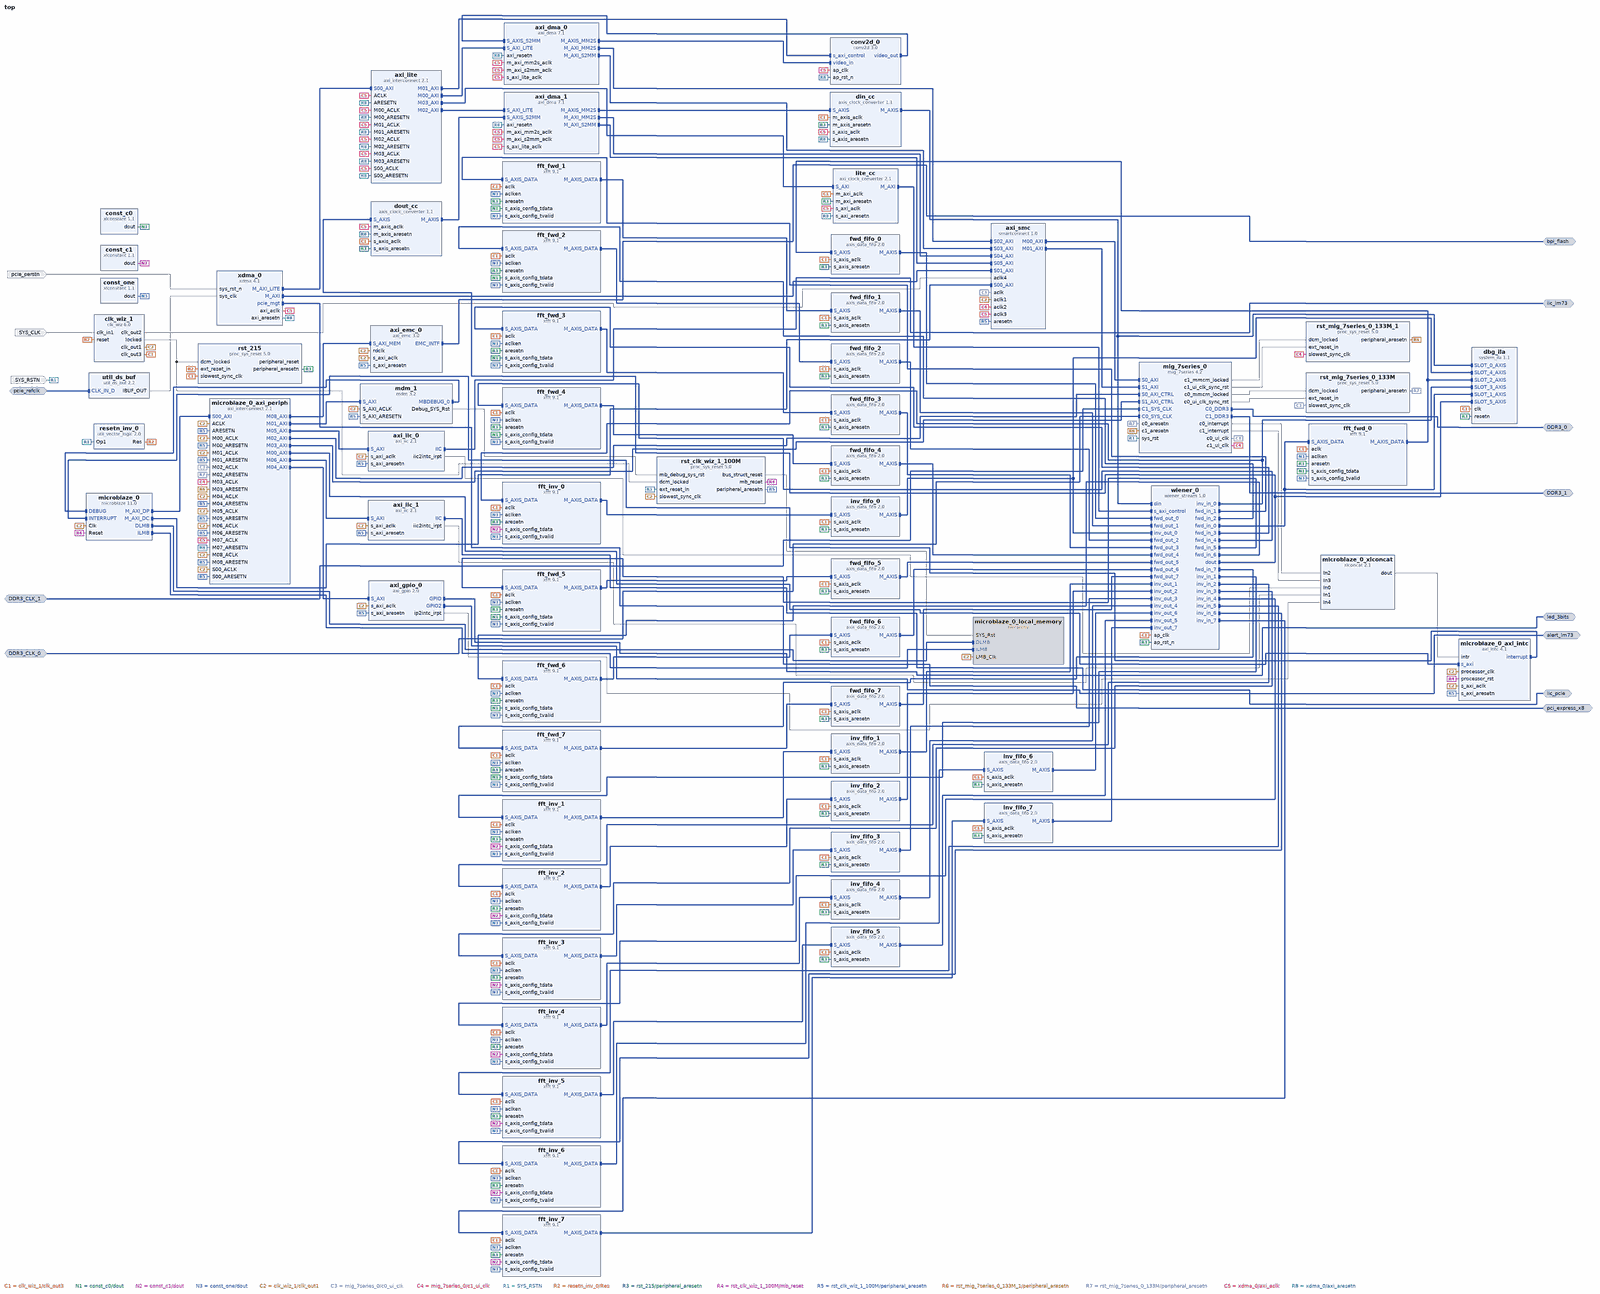
[diagram p0: block diagram of the top level, whole]
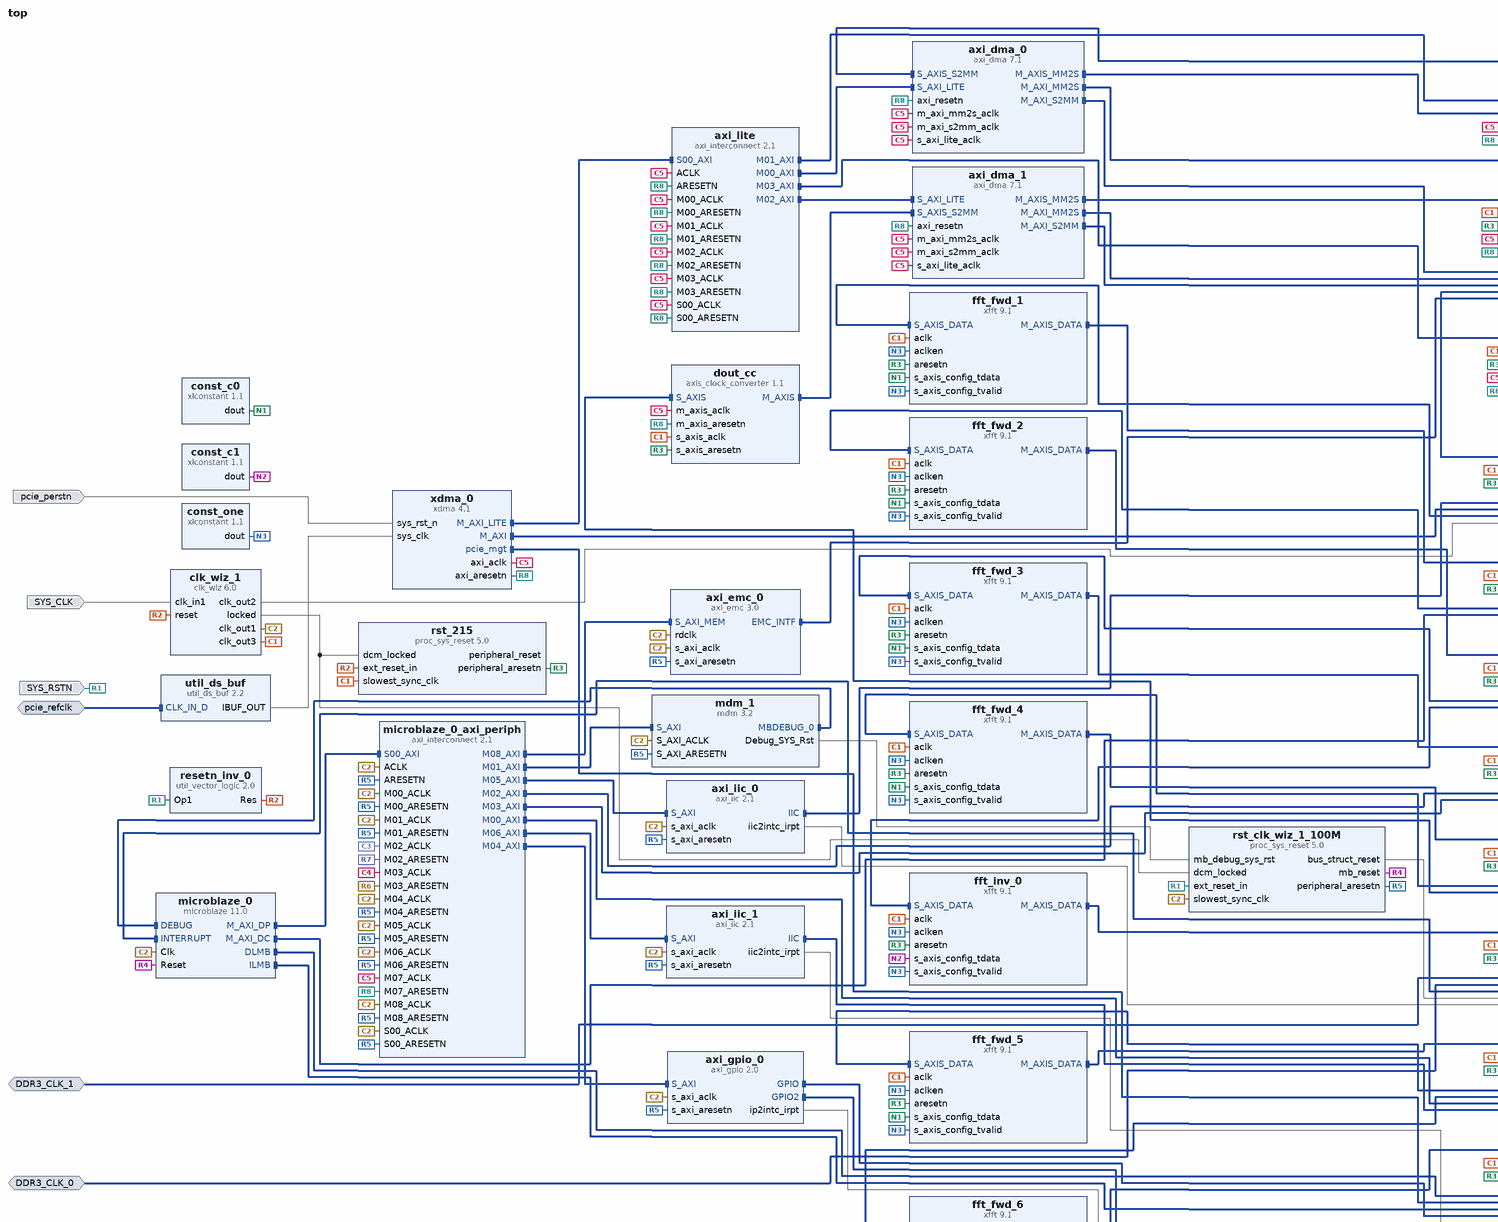
[diagram p1: block diagram of the top level, upper left part]
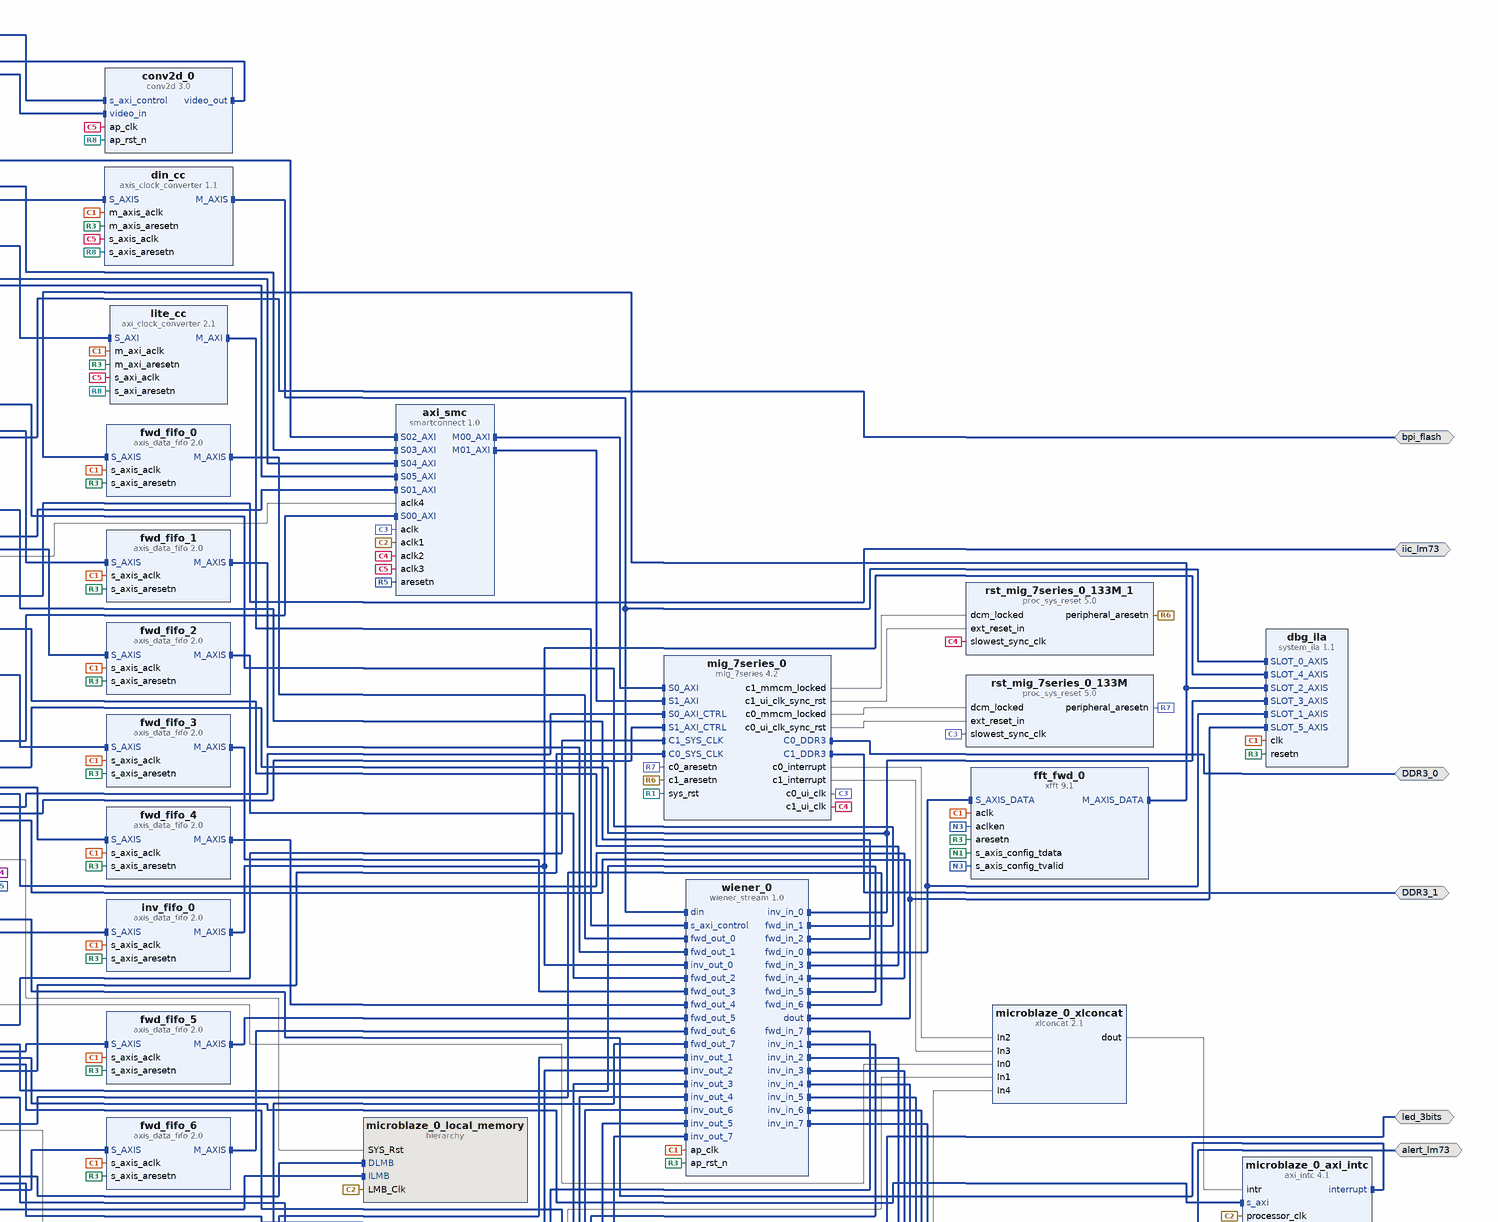
[diagram p2: block diagram of the top level, upper right part]
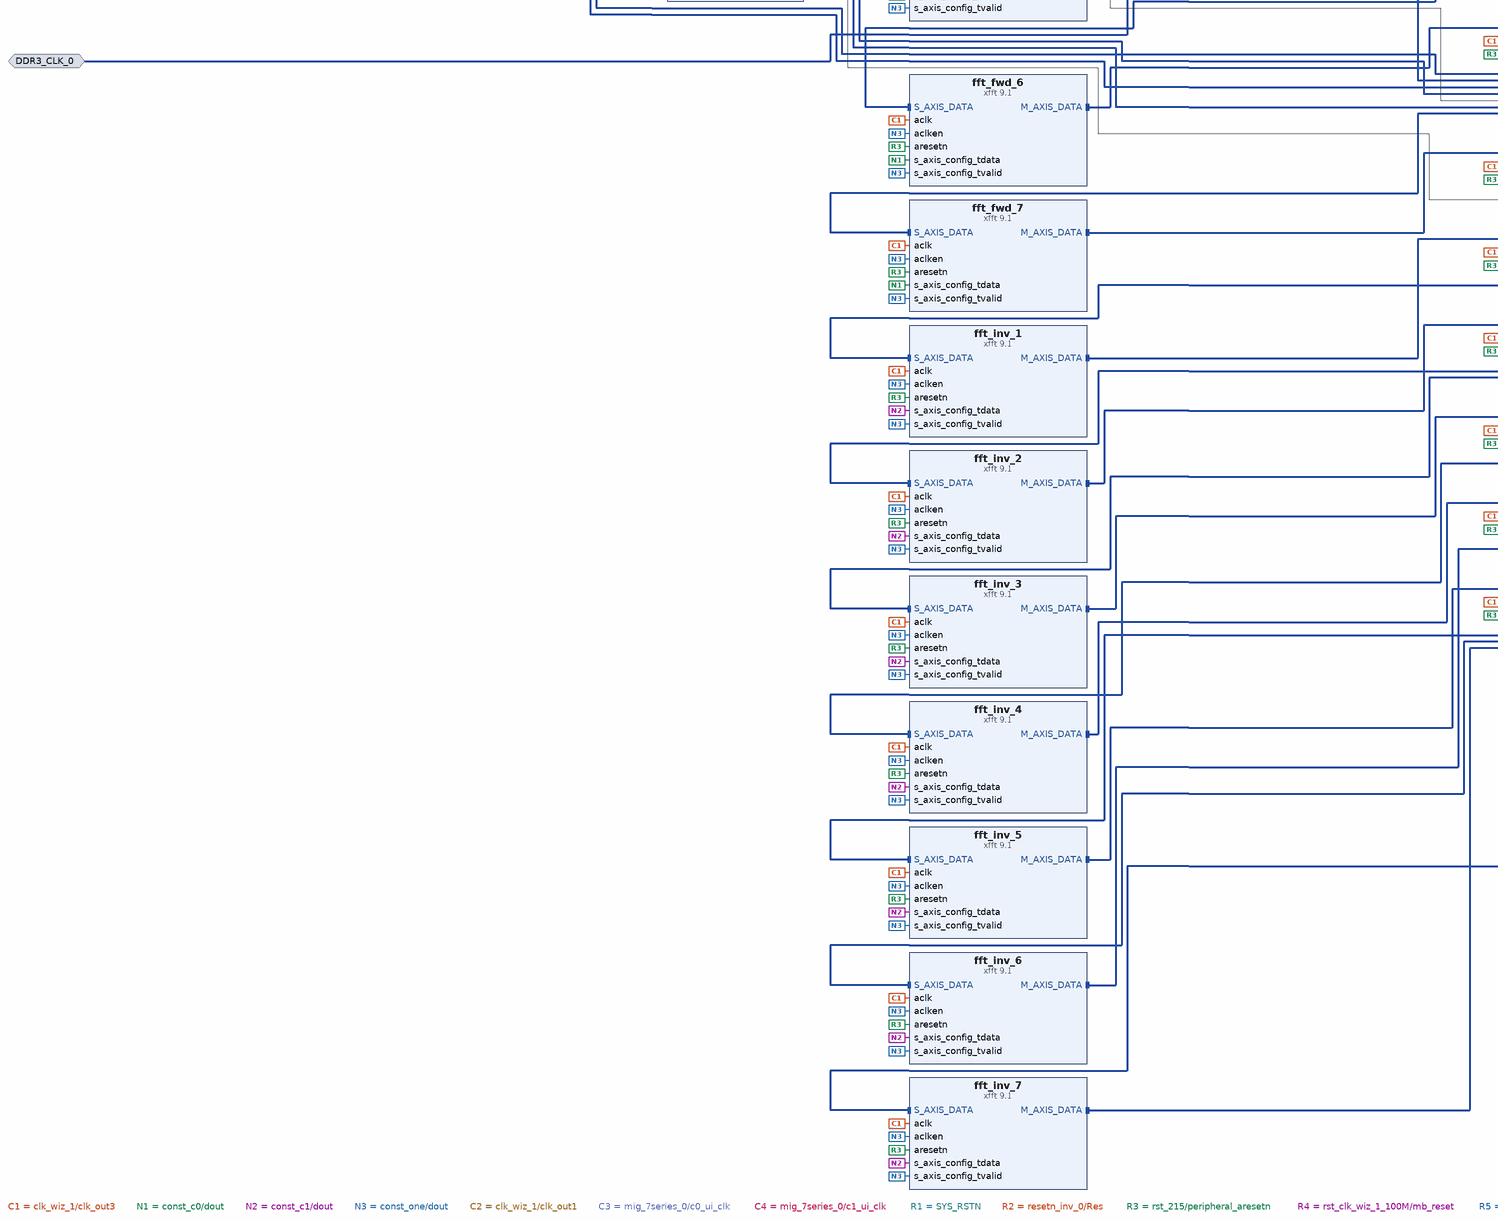
[diagram p3: block diagram of the top level, lower left part]
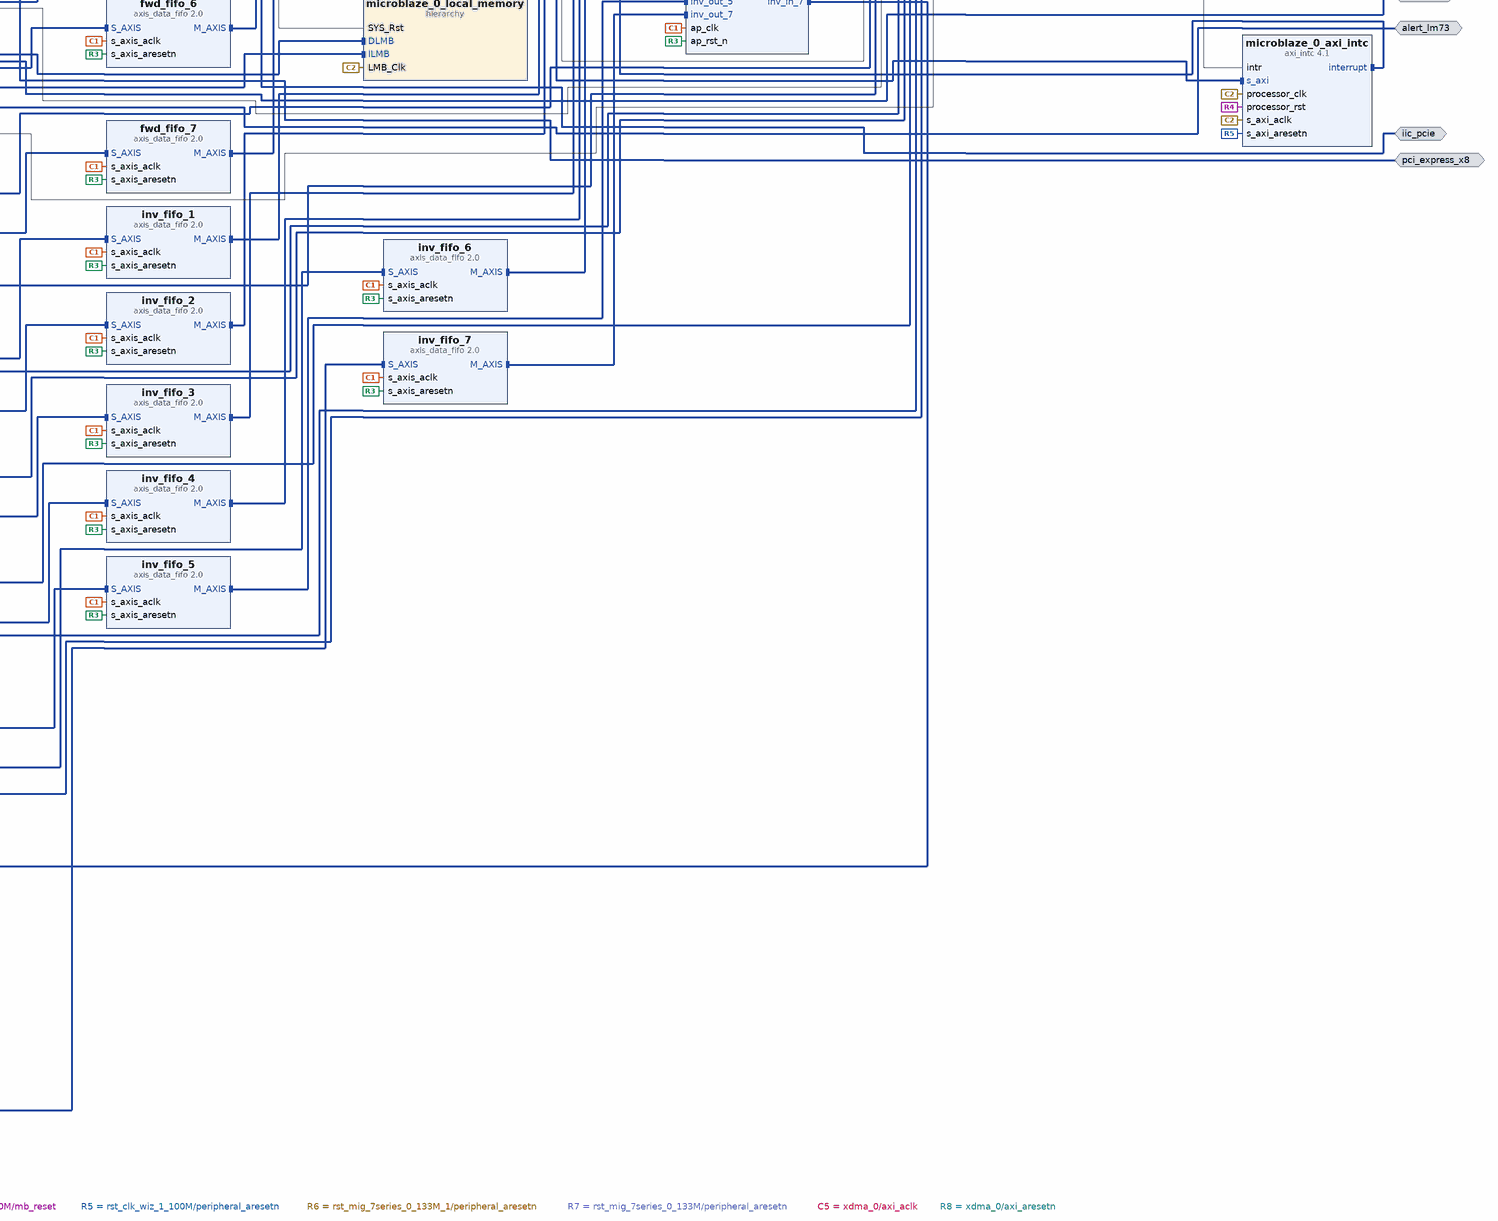
[diagram p4: block diagram of the top level, lower right part]
# Vivado block design top, xc7k480tffg1156-2, Vivado 2024.2
create_bd_design top

create_bd_intf_port -mode Master -vlnv xilinx.com:interface:ddrx_rtl:1.0 DDR3_0
create_bd_intf_port -mode Slave -vlnv xilinx.com:interface:diff_clock_rtl:1.0 DDR3_CLK_0
set_property -dict {CONFIG.FREQ_HZ 100000000} [get_bd_intf_ports DDR3_CLK_0]
create_bd_intf_port -mode Master -vlnv xilinx.com:interface:ddrx_rtl:1.0 DDR3_1
create_bd_intf_port -mode Slave -vlnv xilinx.com:interface:diff_clock_rtl:1.0 DDR3_CLK_1
set_property -dict {CONFIG.FREQ_HZ 100000000} [get_bd_intf_ports DDR3_CLK_1]
create_bd_intf_port -mode Master -vlnv xilinx.com:interface:iic_rtl:1.0 iic_lm73
create_bd_intf_port -mode Master -vlnv xilinx.com:interface:iic_rtl:1.0 iic_pcie
create_bd_intf_port -mode Master -vlnv xilinx.com:interface:pcie_7x_mgt_rtl:1.0 pci_express_x8
create_bd_intf_port -mode Master -vlnv xilinx.com:interface:gpio_rtl:1.0 led_3bits
create_bd_intf_port -mode Master -vlnv xilinx.com:interface:gpio_rtl:1.0 alert_lm73
create_bd_intf_port -mode Master -vlnv xilinx.com:interface:emc_rtl:1.0 bpi_flash
create_bd_intf_port -mode Slave -vlnv xilinx.com:interface:diff_clock_rtl:1.0 pcie_refclk
set_property -dict {CONFIG.FREQ_HZ 100000000} [get_bd_intf_ports pcie_refclk]
create_bd_port -dir I -type clk SYS_CLK
set_property -dict {CONFIG.FREQ_HZ 50000000 CONFIG.PHASE 0.0} [get_bd_ports SYS_CLK]
create_bd_port -dir I -type rst SYS_RSTN
set_property -dict {CONFIG.POLARITY ACTIVE_LOW} [get_bd_ports SYS_RSTN]
create_bd_port -dir I -type rst pcie_perstn
set_property -dict {CONFIG.POLARITY ACTIVE_LOW} [get_bd_ports pcie_perstn]

create_bd_cell -type ip -vlnv xilinx.com:ip:mig_7series:4.2 mig_7series_0
set_property -dict [list \
  CONFIG.BOARD_MIG_PARAM ddr3_sdram_ch01 \
  CONFIG.RESET_BOARD_INTERFACE resetn \
  CONFIG.XML_INPUT_FILE board.prj \
] [get_bd_cells mig_7series_0]
create_bd_cell -type ip -vlnv xilinx.com:ip:microblaze:11.0 microblaze_0
set_property -dict [list \
  CONFIG.C_ADDR_SIZE 36 \
  CONFIG.C_AREA_OPTIMIZED 0 \
  CONFIG.C_DATA_SIZE 32 \
  CONFIG.C_DCACHE_ADDR_TAG 20 \
  CONFIG.C_DCACHE_BASEADDR 0x0000000100000000 \
  CONFIG.C_DCACHE_BYTE_SIZE 4096 \
  CONFIG.C_DCACHE_HIGHADDR 0x00000001FFFFFFFF \
  CONFIG.C_DEBUG_ENABLED 1 \
  CONFIG.C_D_AXI 1 \
  CONFIG.C_D_LMB 1 \
  CONFIG.C_I_LMB 1 \
  CONFIG.C_M_AXI_DC_ADDR_WIDTH 36 \
  CONFIG.C_M_AXI_DP_ADDR_WIDTH 36 \
  CONFIG.C_NUMBER_OF_PC_BRK 8 \
  CONFIG.C_NUMBER_OF_RD_ADDR_BRK 2 \
  CONFIG.C_NUMBER_OF_WR_ADDR_BRK 2 \
  CONFIG.C_PVR 0 \
  CONFIG.C_RESET_MSR_EIP 0 \
  CONFIG.C_USE_BARREL 1 \
  CONFIG.C_USE_DCACHE 1 \
  CONFIG.C_USE_HW_MUL 1 \
  CONFIG.C_USE_MSR_INSTR 1 \
  CONFIG.C_USE_PCMP_INSTR 1 \
  CONFIG.C_USE_REORDER_INSTR 0 \
  CONFIG.G_TEMPLATE_LIST 8 \
] [get_bd_cells microblaze_0]
create_bd_cell -type hier microblaze_0_local_memory
create_bd_cell -type ip -vlnv xilinx.com:ip:axi_interconnect:2.1 microblaze_0_axi_periph
set_property -dict {CONFIG.NUM_MI 9} [get_bd_cells microblaze_0_axi_periph]
create_bd_cell -type ip -vlnv xilinx.com:ip:axi_intc:4.1 microblaze_0_axi_intc
set_property -dict {CONFIG.C_HAS_FAST 1} [get_bd_cells microblaze_0_axi_intc]
create_bd_cell -type ip -vlnv xilinx.com:ip:xlconcat:2.1 microblaze_0_xlconcat
set_property -dict {CONFIG.NUM_PORTS 5 CONFIG.dout_width 5} [get_bd_cells microblaze_0_xlconcat]
create_bd_cell -type ip -vlnv xilinx.com:ip:mdm:3.2 mdm_1
set_property -dict {CONFIG.C_ADDR_SIZE 32 CONFIG.C_M_AXI_ADDR_WIDTH 32 CONFIG.C_USE_UART 1} [get_bd_cells mdm_1]
create_bd_cell -type ip -vlnv xilinx.com:ip:clk_wiz:6.0 clk_wiz_1
set_property -dict [list \
  CONFIG.CLKIN1_JITTER_PS 200.0 \
  CONFIG.CLKOUT1_JITTER 134.260 \
  CONFIG.CLKOUT1_PHASE_ERROR 150.621 \
  CONFIG.CLKOUT2_JITTER 116.243 \
  CONFIG.CLKOUT2_PHASE_ERROR 150.621 \
  CONFIG.CLKOUT2_REQUESTED_OUT_FREQ 250.000 \
  CONFIG.CLKOUT2_USED true \
  CONFIG.CLKOUT3_REQUESTED_OUT_FREQ 180 \
  CONFIG.CLKOUT3_USED true \
  CONFIG.CLK_IN1_BOARD_INTERFACE default_50mhz_clk0 \
  CONFIG.MMCM_CLKFBOUT_MULT_F 25.000 \
  CONFIG.MMCM_CLKIN1_PERIOD 20.000 \
  CONFIG.MMCM_CLKIN2_PERIOD 10.0 \
  CONFIG.MMCM_CLKOUT1_DIVIDE 5 \
  CONFIG.NUM_OUT_CLKS 3 \
  CONFIG.PRIM_SOURCE Single_ended_clock_capable_pin \
  CONFIG.RESET_BOARD_INTERFACE resetn \
  CONFIG.USE_BOARD_FLOW true \
] [get_bd_cells clk_wiz_1]
create_bd_cell -type ip -vlnv xilinx.com:ip:proc_sys_reset:5.0 rst_clk_wiz_1_100M
set_property -dict [list \
  CONFIG.C_EXT_RESET_HIGH 0 \
  CONFIG.RESET_BOARD_INTERFACE resetn \
  CONFIG.USE_BOARD_FLOW true \
] [get_bd_cells rst_clk_wiz_1_100M]
create_bd_cell -type ip -vlnv xilinx.com:ip:util_vector_logic:2.0 resetn_inv_0
set_property -dict {CONFIG.C_OPERATION not CONFIG.C_SIZE 1} [get_bd_cells resetn_inv_0]
create_bd_cell -type ip -vlnv xilinx.com:ip:proc_sys_reset:5.0 rst_mig_7series_0_133M
create_bd_cell -type ip -vlnv xilinx.com:ip:proc_sys_reset:5.0 rst_mig_7series_0_133M_1
create_bd_cell -type ip -vlnv xilinx.com:ip:axi_emc:3.0 axi_emc_0
set_property -dict [list \
  CONFIG.C_MEM0_TYPE 2 \
  CONFIG.C_TAVDV_PS_MEM_0 96000 \
  CONFIG.C_TCEDV_PS_MEM_0 96000 \
  CONFIG.C_THZCE_PS_MEM_0 9000 \
  CONFIG.C_THZOE_PS_MEM_0 9000 \
  CONFIG.C_TLZWE_PS_MEM_0 20000 \
  CONFIG.C_TWC_PS_MEM_0 40000 \
  CONFIG.C_TWPH_PS_MEM_0 20000 \
  CONFIG.C_TWP_PS_MEM_0 40000 \
  CONFIG.C_WR_REC_TIME_MEM_0 200000 \
  CONFIG.EMC_BOARD_INTERFACE bpi_flash \
  CONFIG.USE_BOARD_FLOW true \
] [get_bd_cells axi_emc_0]
create_bd_cell -type ip -vlnv xilinx.com:ip:axi_iic:2.1 axi_iic_0
set_property -dict {CONFIG.IIC_BOARD_INTERFACE iic_lm73 CONFIG.USE_BOARD_FLOW true} [get_bd_cells axi_iic_0]
create_bd_cell -type ip -vlnv xilinx.com:ip:axi_iic:2.1 axi_iic_1
set_property -dict {CONFIG.IIC_BOARD_INTERFACE iic_pcie CONFIG.USE_BOARD_FLOW true} [get_bd_cells axi_iic_1]
create_bd_cell -type ip -vlnv xilinx.com:ip:xdma:4.1 xdma_0
set_property -dict [list \
  CONFIG.SYS_RST_N_BOARD_INTERFACE Custom \
  CONFIG.axilite_master_en true \
  CONFIG.axilite_master_scale Kilobytes \
  CONFIG.axilite_master_size 64 \
  CONFIG.pl_link_cap_max_link_speed 5.0_GT/s \
  CONFIG.pl_link_cap_max_link_width X8 \
] [get_bd_cells xdma_0]
create_bd_cell -type ip -vlnv xilinx.com:ip:util_ds_buf:2.2 util_ds_buf
set_property -dict {CONFIG.DIFF_CLK_IN_BOARD_INTERFACE pcie_refclk CONFIG.USE_BOARD_FLOW true} [get_bd_cells util_ds_buf]
create_bd_cell -type ip -vlnv xilinx.com:ip:axi_gpio:2.0 axi_gpio_0
set_property -dict [list \
  CONFIG.C_INTERRUPT_PRESENT 1 \
  CONFIG.GPIO2_BOARD_INTERFACE alert_lm73 \
  CONFIG.GPIO_BOARD_INTERFACE led_3bits \
  CONFIG.USE_BOARD_FLOW true \
] [get_bd_cells axi_gpio_0]
create_bd_cell -type ip -vlnv xilinx.com:ip:smartconnect:1.0 axi_smc
set_property -dict {CONFIG.NUM_CLKS 5 CONFIG.NUM_MI 2 CONFIG.NUM_SI 6} [get_bd_cells axi_smc]
create_bd_cell -type ip -vlnv xilinx.com:ip:axi_dma:7.1 axi_dma_0
set_property -dict [list \
  CONFIG.c_addr_width 32 \
  CONFIG.c_include_mm2s 1 \
  CONFIG.c_include_s2mm 1 \
  CONFIG.c_include_sg 0 \
  CONFIG.c_m_axi_mm2s_data_width 64 \
  CONFIG.c_m_axi_s2mm_data_width 64 \
  CONFIG.c_m_axis_mm2s_tdata_width 32 \
  CONFIG.c_micro_dma 0 \
  CONFIG.c_s_axis_s2mm_tdata_width 32 \
  CONFIG.c_sg_length_width 26 \
] [get_bd_cells axi_dma_0]
create_bd_cell -type ip -vlnv xilinx.com:ip:axi_interconnect:2.1 axi_lite
set_property -dict {CONFIG.NUM_MI 4 CONFIG.NUM_SI 1} [get_bd_cells axi_lite]
create_bd_cell -type ip -vlnv user:hls:conv2d:3.0 conv2d_0
create_bd_cell -type ip -vlnv xilinx.com:ip:proc_sys_reset:5.0 rst_215
create_bd_cell -type ip -vlnv xilinx.com:ip:xlconstant:1.1 const_one
set_property -dict {CONFIG.CONST_VAL 1 CONFIG.CONST_WIDTH 1} [get_bd_cells const_one]
create_bd_cell -type ip -vlnv xilinx.com:ip:xlconstant:1.1 const_c0
set_property -dict {CONFIG.CONST_VAL 0 CONFIG.CONST_WIDTH 8} [get_bd_cells const_c0]
create_bd_cell -type ip -vlnv xilinx.com:ip:xlconstant:1.1 const_c1
set_property -dict {CONFIG.CONST_VAL 1 CONFIG.CONST_WIDTH 8} [get_bd_cells const_c1]
create_bd_cell -type ip -vlnv xilinx.com:ip:axi_dma:7.1 axi_dma_1
set_property -dict [list \
  CONFIG.c_addr_width 32 \
  CONFIG.c_include_mm2s 1 \
  CONFIG.c_include_s2mm 1 \
  CONFIG.c_include_sg 0 \
  CONFIG.c_m_axi_mm2s_data_width 64 \
  CONFIG.c_m_axi_s2mm_data_width 64 \
  CONFIG.c_m_axis_mm2s_tdata_width 32 \
  CONFIG.c_s_axis_s2mm_tdata_width 32 \
  CONFIG.c_sg_length_width 26 \
] [get_bd_cells axi_dma_1]
create_bd_cell -type ip -vlnv user:hls:wiener_stream:1.0 wiener_0
create_bd_cell -type ip -vlnv xilinx.com:ip:xfft:9.1 fft_fwd_0
set_property -dict [list \
  CONFIG.aclken true \
  CONFIG.aresetn true \
  CONFIG.data_format fixed_point \
  CONFIG.implementation_options pipelined_streaming_io \
  CONFIG.input_width 24 \
  CONFIG.output_ordering natural_order \
  CONFIG.ovflo false \
  CONFIG.phase_factor_width 16 \
  CONFIG.rounding_modes convergent_rounding \
  CONFIG.scaling_options unscaled \
  CONFIG.throttle_scheme realtime \
  CONFIG.transform_length 256 \
] [get_bd_cells fft_fwd_0]
create_bd_cell -type ip -vlnv xilinx.com:ip:xfft:9.1 fft_inv_0
set_property -dict [list \
  CONFIG.aclken true \
  CONFIG.aresetn true \
  CONFIG.data_format fixed_point \
  CONFIG.implementation_options pipelined_streaming_io \
  CONFIG.input_width 24 \
  CONFIG.output_ordering natural_order \
  CONFIG.ovflo false \
  CONFIG.phase_factor_width 16 \
  CONFIG.rounding_modes convergent_rounding \
  CONFIG.scaling_options unscaled \
  CONFIG.throttle_scheme realtime \
  CONFIG.transform_length 256 \
] [get_bd_cells fft_inv_0]
create_bd_cell -type ip -vlnv xilinx.com:ip:xfft:9.1 fft_fwd_1
set_property -dict [list \
  CONFIG.aclken true \
  CONFIG.aresetn true \
  CONFIG.data_format fixed_point \
  CONFIG.implementation_options pipelined_streaming_io \
  CONFIG.input_width 24 \
  CONFIG.output_ordering natural_order \
  CONFIG.ovflo false \
  CONFIG.phase_factor_width 16 \
  CONFIG.rounding_modes convergent_rounding \
  CONFIG.scaling_options unscaled \
  CONFIG.throttle_scheme realtime \
  CONFIG.transform_length 256 \
] [get_bd_cells fft_fwd_1]
create_bd_cell -type ip -vlnv xilinx.com:ip:xfft:9.1 fft_inv_1
set_property -dict [list \
  CONFIG.aclken true \
  CONFIG.aresetn true \
  CONFIG.data_format fixed_point \
  CONFIG.implementation_options pipelined_streaming_io \
  CONFIG.input_width 24 \
  CONFIG.output_ordering natural_order \
  CONFIG.ovflo false \
  CONFIG.phase_factor_width 16 \
  CONFIG.rounding_modes convergent_rounding \
  CONFIG.scaling_options unscaled \
  CONFIG.throttle_scheme realtime \
  CONFIG.transform_length 256 \
] [get_bd_cells fft_inv_1]
create_bd_cell -type ip -vlnv xilinx.com:ip:xfft:9.1 fft_fwd_2
set_property -dict [list \
  CONFIG.aclken true \
  CONFIG.aresetn true \
  CONFIG.data_format fixed_point \
  CONFIG.implementation_options pipelined_streaming_io \
  CONFIG.input_width 24 \
  CONFIG.output_ordering natural_order \
  CONFIG.ovflo false \
  CONFIG.phase_factor_width 16 \
  CONFIG.rounding_modes convergent_rounding \
  CONFIG.scaling_options unscaled \
  CONFIG.throttle_scheme realtime \
  CONFIG.transform_length 256 \
] [get_bd_cells fft_fwd_2]
create_bd_cell -type ip -vlnv xilinx.com:ip:xfft:9.1 fft_inv_2
set_property -dict [list \
  CONFIG.aclken true \
  CONFIG.aresetn true \
  CONFIG.data_format fixed_point \
  CONFIG.implementation_options pipelined_streaming_io \
  CONFIG.input_width 24 \
  CONFIG.output_ordering natural_order \
  CONFIG.ovflo false \
  CONFIG.phase_factor_width 16 \
  CONFIG.rounding_modes convergent_rounding \
  CONFIG.scaling_options unscaled \
  CONFIG.throttle_scheme realtime \
  CONFIG.transform_length 256 \
] [get_bd_cells fft_inv_2]
create_bd_cell -type ip -vlnv xilinx.com:ip:xfft:9.1 fft_fwd_3
set_property -dict [list \
  CONFIG.aclken true \
  CONFIG.aresetn true \
  CONFIG.data_format fixed_point \
  CONFIG.implementation_options pipelined_streaming_io \
  CONFIG.input_width 24 \
  CONFIG.output_ordering natural_order \
  CONFIG.ovflo false \
  CONFIG.phase_factor_width 16 \
  CONFIG.rounding_modes convergent_rounding \
  CONFIG.scaling_options unscaled \
  CONFIG.throttle_scheme realtime \
  CONFIG.transform_length 256 \
] [get_bd_cells fft_fwd_3]
create_bd_cell -type ip -vlnv xilinx.com:ip:xfft:9.1 fft_inv_3
set_property -dict [list \
  CONFIG.aclken true \
  CONFIG.aresetn true \
  CONFIG.data_format fixed_point \
  CONFIG.implementation_options pipelined_streaming_io \
  CONFIG.input_width 24 \
  CONFIG.output_ordering natural_order \
  CONFIG.ovflo false \
  CONFIG.phase_factor_width 16 \
  CONFIG.rounding_modes convergent_rounding \
  CONFIG.scaling_options unscaled \
  CONFIG.throttle_scheme realtime \
  CONFIG.transform_length 256 \
] [get_bd_cells fft_inv_3]
create_bd_cell -type ip -vlnv xilinx.com:ip:xfft:9.1 fft_fwd_4
set_property -dict [list \
  CONFIG.aclken true \
  CONFIG.aresetn true \
  CONFIG.data_format fixed_point \
  CONFIG.implementation_options pipelined_streaming_io \
  CONFIG.input_width 24 \
  CONFIG.output_ordering natural_order \
  CONFIG.ovflo false \
  CONFIG.phase_factor_width 16 \
  CONFIG.rounding_modes convergent_rounding \
  CONFIG.scaling_options unscaled \
  CONFIG.throttle_scheme realtime \
  CONFIG.transform_length 256 \
] [get_bd_cells fft_fwd_4]
create_bd_cell -type ip -vlnv xilinx.com:ip:xfft:9.1 fft_inv_4
set_property -dict [list \
  CONFIG.aclken true \
  CONFIG.aresetn true \
  CONFIG.data_format fixed_point \
  CONFIG.implementation_options pipelined_streaming_io \
  CONFIG.input_width 24 \
  CONFIG.output_ordering natural_order \
  CONFIG.ovflo false \
  CONFIG.phase_factor_width 16 \
  CONFIG.rounding_modes convergent_rounding \
  CONFIG.scaling_options unscaled \
  CONFIG.throttle_scheme realtime \
  CONFIG.transform_length 256 \
] [get_bd_cells fft_inv_4]
create_bd_cell -type ip -vlnv xilinx.com:ip:xfft:9.1 fft_fwd_5
set_property -dict [list \
  CONFIG.aclken true \
  CONFIG.aresetn true \
  CONFIG.data_format fixed_point \
  CONFIG.implementation_options pipelined_streaming_io \
  CONFIG.input_width 24 \
  CONFIG.output_ordering natural_order \
  CONFIG.ovflo false \
  CONFIG.phase_factor_width 16 \
  CONFIG.rounding_modes convergent_rounding \
  CONFIG.scaling_options unscaled \
  CONFIG.throttle_scheme realtime \
  CONFIG.transform_length 256 \
] [get_bd_cells fft_fwd_5]
create_bd_cell -type ip -vlnv xilinx.com:ip:xfft:9.1 fft_inv_5
set_property -dict [list \
  CONFIG.aclken true \
  CONFIG.aresetn true \
  CONFIG.data_format fixed_point \
  CONFIG.implementation_options pipelined_streaming_io \
  CONFIG.input_width 24 \
  CONFIG.output_ordering natural_order \
  CONFIG.ovflo false \
  CONFIG.phase_factor_width 16 \
  CONFIG.rounding_modes convergent_rounding \
  CONFIG.scaling_options unscaled \
  CONFIG.throttle_scheme realtime \
  CONFIG.transform_length 256 \
] [get_bd_cells fft_inv_5]
create_bd_cell -type ip -vlnv xilinx.com:ip:xfft:9.1 fft_fwd_6
set_property -dict [list \
  CONFIG.aclken true \
  CONFIG.aresetn true \
  CONFIG.data_format fixed_point \
  CONFIG.implementation_options pipelined_streaming_io \
  CONFIG.input_width 24 \
  CONFIG.output_ordering natural_order \
  CONFIG.ovflo false \
  CONFIG.phase_factor_width 16 \
  CONFIG.rounding_modes convergent_rounding \
  CONFIG.scaling_options unscaled \
  CONFIG.throttle_scheme realtime \
  CONFIG.transform_length 256 \
] [get_bd_cells fft_fwd_6]
create_bd_cell -type ip -vlnv xilinx.com:ip:xfft:9.1 fft_inv_6
set_property -dict [list \
  CONFIG.aclken true \
  CONFIG.aresetn true \
  CONFIG.data_format fixed_point \
  CONFIG.implementation_options pipelined_streaming_io \
  CONFIG.input_width 24 \
  CONFIG.output_ordering natural_order \
  CONFIG.ovflo false \
  CONFIG.phase_factor_width 16 \
  CONFIG.rounding_modes convergent_rounding \
  CONFIG.scaling_options unscaled \
  CONFIG.throttle_scheme realtime \
  CONFIG.transform_length 256 \
] [get_bd_cells fft_inv_6]
create_bd_cell -type ip -vlnv xilinx.com:ip:xfft:9.1 fft_fwd_7
set_property -dict [list \
  CONFIG.aclken true \
  CONFIG.aresetn true \
  CONFIG.data_format fixed_point \
  CONFIG.implementation_options pipelined_streaming_io \
  CONFIG.input_width 24 \
  CONFIG.output_ordering natural_order \
  CONFIG.ovflo false \
  CONFIG.phase_factor_width 16 \
  CONFIG.rounding_modes convergent_rounding \
  CONFIG.scaling_options unscaled \
  CONFIG.throttle_scheme realtime \
  CONFIG.transform_length 256 \
] [get_bd_cells fft_fwd_7]
create_bd_cell -type ip -vlnv xilinx.com:ip:xfft:9.1 fft_inv_7
set_property -dict [list \
  CONFIG.aclken true \
  CONFIG.aresetn true \
  CONFIG.data_format fixed_point \
  CONFIG.implementation_options pipelined_streaming_io \
  CONFIG.input_width 24 \
  CONFIG.output_ordering natural_order \
  CONFIG.ovflo false \
  CONFIG.phase_factor_width 16 \
  CONFIG.rounding_modes convergent_rounding \
  CONFIG.scaling_options unscaled \
  CONFIG.throttle_scheme realtime \
  CONFIG.transform_length 256 \
] [get_bd_cells fft_inv_7]
create_bd_cell -type ip -vlnv xilinx.com:ip:axis_clock_converter:1.1 din_cc
set_property -dict {CONFIG.HAS_TKEEP 1 CONFIG.HAS_TLAST 1 CONFIG.HAS_TSTRB 1 CONFIG.TDATA_NUM_BYTES 4} [get_bd_cells din_cc]
create_bd_cell -type ip -vlnv xilinx.com:ip:axis_clock_converter:1.1 dout_cc
set_property -dict {CONFIG.HAS_TKEEP 1 CONFIG.HAS_TLAST 1 CONFIG.HAS_TSTRB 1 CONFIG.TDATA_NUM_BYTES 4} [get_bd_cells dout_cc]
create_bd_cell -type ip -vlnv xilinx.com:ip:axi_clock_converter:2.1 lite_cc
set_property -dict {CONFIG.ADDR_WIDTH 13 CONFIG.DATA_WIDTH 32 CONFIG.PROTOCOL AXI4LITE} [get_bd_cells lite_cc]
create_bd_cell -type ip -vlnv xilinx.com:ip:axis_data_fifo:2.0 fwd_fifo_0
set_property -dict [list \
  CONFIG.FIFO_DEPTH 2048 \
  CONFIG.HAS_TKEEP 0 \
  CONFIG.HAS_TLAST 1 \
  CONFIG.HAS_TSTRB 0 \
  CONFIG.TDATA_NUM_BYTES 10 \
] [get_bd_cells fwd_fifo_0]
create_bd_cell -type ip -vlnv xilinx.com:ip:axis_data_fifo:2.0 fwd_fifo_1
set_property -dict [list \
  CONFIG.FIFO_DEPTH 2048 \
  CONFIG.HAS_TKEEP 0 \
  CONFIG.HAS_TLAST 1 \
  CONFIG.HAS_TSTRB 0 \
  CONFIG.TDATA_NUM_BYTES 10 \
] [get_bd_cells fwd_fifo_1]
create_bd_cell -type ip -vlnv xilinx.com:ip:axis_data_fifo:2.0 fwd_fifo_2
set_property -dict [list \
  CONFIG.FIFO_DEPTH 2048 \
  CONFIG.HAS_TKEEP 0 \
  CONFIG.HAS_TLAST 1 \
  CONFIG.HAS_TSTRB 0 \
  CONFIG.TDATA_NUM_BYTES 10 \
] [get_bd_cells fwd_fifo_2]
create_bd_cell -type ip -vlnv xilinx.com:ip:axis_data_fifo:2.0 fwd_fifo_3
set_property -dict [list \
  CONFIG.FIFO_DEPTH 2048 \
  CONFIG.HAS_TKEEP 0 \
  CONFIG.HAS_TLAST 1 \
  CONFIG.HAS_TSTRB 0 \
  CONFIG.TDATA_NUM_BYTES 10 \
] [get_bd_cells fwd_fifo_3]
create_bd_cell -type ip -vlnv xilinx.com:ip:axis_data_fifo:2.0 fwd_fifo_4
set_property -dict [list \
  CONFIG.FIFO_DEPTH 2048 \
  CONFIG.HAS_TKEEP 0 \
  CONFIG.HAS_TLAST 1 \
  CONFIG.HAS_TSTRB 0 \
  CONFIG.TDATA_NUM_BYTES 10 \
] [get_bd_cells fwd_fifo_4]
create_bd_cell -type ip -vlnv xilinx.com:ip:axis_data_fifo:2.0 fwd_fifo_5
set_property -dict [list \
  CONFIG.FIFO_DEPTH 2048 \
  CONFIG.HAS_TKEEP 0 \
  CONFIG.HAS_TLAST 1 \
  CONFIG.HAS_TSTRB 0 \
  CONFIG.TDATA_NUM_BYTES 10 \
] [get_bd_cells fwd_fifo_5]
create_bd_cell -type ip -vlnv xilinx.com:ip:axis_data_fifo:2.0 fwd_fifo_6
set_property -dict [list \
  CONFIG.FIFO_DEPTH 2048 \
  CONFIG.HAS_TKEEP 0 \
  CONFIG.HAS_TLAST 1 \
  CONFIG.HAS_TSTRB 0 \
  CONFIG.TDATA_NUM_BYTES 10 \
] [get_bd_cells fwd_fifo_6]
create_bd_cell -type ip -vlnv xilinx.com:ip:axis_data_fifo:2.0 fwd_fifo_7
set_property -dict [list \
  CONFIG.FIFO_DEPTH 2048 \
  CONFIG.HAS_TKEEP 0 \
  CONFIG.HAS_TLAST 1 \
  CONFIG.HAS_TSTRB 0 \
  CONFIG.TDATA_NUM_BYTES 10 \
] [get_bd_cells fwd_fifo_7]
create_bd_cell -type ip -vlnv xilinx.com:ip:axis_data_fifo:2.0 inv_fifo_0
set_property -dict [list \
  CONFIG.FIFO_DEPTH 2048 \
  CONFIG.HAS_TKEEP 0 \
  CONFIG.HAS_TLAST 1 \
  CONFIG.HAS_TSTRB 0 \
  CONFIG.TDATA_NUM_BYTES 10 \
] [get_bd_cells inv_fifo_0]
create_bd_cell -type ip -vlnv xilinx.com:ip:axis_data_fifo:2.0 inv_fifo_1
set_property -dict [list \
  CONFIG.FIFO_DEPTH 2048 \
  CONFIG.HAS_TKEEP 0 \
  CONFIG.HAS_TLAST 1 \
  CONFIG.HAS_TSTRB 0 \
  CONFIG.TDATA_NUM_BYTES 10 \
] [get_bd_cells inv_fifo_1]
create_bd_cell -type ip -vlnv xilinx.com:ip:axis_data_fifo:2.0 inv_fifo_2
set_property -dict [list \
  CONFIG.FIFO_DEPTH 2048 \
  CONFIG.HAS_TKEEP 0 \
  CONFIG.HAS_TLAST 1 \
  CONFIG.HAS_TSTRB 0 \
  CONFIG.TDATA_NUM_BYTES 10 \
] [get_bd_cells inv_fifo_2]
create_bd_cell -type ip -vlnv xilinx.com:ip:axis_data_fifo:2.0 inv_fifo_3
set_property -dict [list \
  CONFIG.FIFO_DEPTH 2048 \
  CONFIG.HAS_TKEEP 0 \
  CONFIG.HAS_TLAST 1 \
  CONFIG.HAS_TSTRB 0 \
  CONFIG.TDATA_NUM_BYTES 10 \
] [get_bd_cells inv_fifo_3]
create_bd_cell -type ip -vlnv xilinx.com:ip:axis_data_fifo:2.0 inv_fifo_4
set_property -dict [list \
  CONFIG.FIFO_DEPTH 2048 \
  CONFIG.HAS_TKEEP 0 \
  CONFIG.HAS_TLAST 1 \
  CONFIG.HAS_TSTRB 0 \
  CONFIG.TDATA_NUM_BYTES 10 \
] [get_bd_cells inv_fifo_4]
create_bd_cell -type ip -vlnv xilinx.com:ip:axis_data_fifo:2.0 inv_fifo_5
set_property -dict [list \
  CONFIG.FIFO_DEPTH 2048 \
  CONFIG.HAS_TKEEP 0 \
  CONFIG.HAS_TLAST 1 \
  CONFIG.HAS_TSTRB 0 \
  CONFIG.TDATA_NUM_BYTES 10 \
] [get_bd_cells inv_fifo_5]
create_bd_cell -type ip -vlnv xilinx.com:ip:axis_data_fifo:2.0 inv_fifo_6
set_property -dict [list \
  CONFIG.FIFO_DEPTH 2048 \
  CONFIG.HAS_TKEEP 0 \
  CONFIG.HAS_TLAST 1 \
  CONFIG.HAS_TSTRB 0 \
  CONFIG.TDATA_NUM_BYTES 10 \
] [get_bd_cells inv_fifo_6]
create_bd_cell -type ip -vlnv xilinx.com:ip:axis_data_fifo:2.0 inv_fifo_7
set_property -dict [list \
  CONFIG.FIFO_DEPTH 2048 \
  CONFIG.HAS_TKEEP 0 \
  CONFIG.HAS_TLAST 1 \
  CONFIG.HAS_TSTRB 0 \
  CONFIG.TDATA_NUM_BYTES 10 \
] [get_bd_cells inv_fifo_7]
create_bd_cell -type ip -vlnv xilinx.com:ip:system_ila:1.1 dbg_ila
set_property -dict [list \
  CONFIG.C_DATA_DEPTH 8192 \
  CONFIG.C_NUM_MONITOR_SLOTS 6 \
  CONFIG.C_SLOT_0_INTF_TYPE xilinx.com:interface:axis_rtl:1.0 \
  CONFIG.C_SLOT_1_INTF_TYPE xilinx.com:interface:axis_rtl:1.0 \
  CONFIG.C_SLOT_2_INTF_TYPE xilinx.com:interface:axis_rtl:1.0 \
  CONFIG.C_SLOT_3_INTF_TYPE xilinx.com:interface:axis_rtl:1.0 \
  CONFIG.C_SLOT_4_INTF_TYPE xilinx.com:interface:axis_rtl:1.0 \
  CONFIG.C_SLOT_5_INTF_TYPE xilinx.com:interface:axis_rtl:1.0 \
] [get_bd_cells dbg_ila]

# ---- hierarchy /microblaze_0_local_memory ----
current_bd_instance /microblaze_0_local_memory
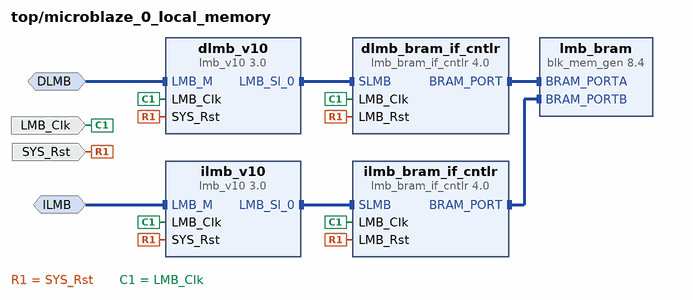
[diagram p5: block diagram inside /microblaze_0_local_memory]
create_bd_intf_pin -mode MirroredMaster -vlnv xilinx.com:interface:lmb_rtl:1.0 DLMB
create_bd_intf_pin -mode MirroredMaster -vlnv xilinx.com:interface:lmb_rtl:1.0 ILMB
create_bd_pin -dir I -type clk LMB_Clk
create_bd_pin -dir I -type rst SYS_Rst

create_bd_cell -type ip -vlnv xilinx.com:ip:lmb_v10:3.0 dlmb_v10
create_bd_cell -type ip -vlnv xilinx.com:ip:lmb_v10:3.0 ilmb_v10
create_bd_cell -type ip -vlnv xilinx.com:ip:lmb_bram_if_cntlr:4.0 dlmb_bram_if_cntlr
set_property -dict {CONFIG.C_ECC 0} [get_bd_cells dlmb_bram_if_cntlr]
create_bd_cell -type ip -vlnv xilinx.com:ip:lmb_bram_if_cntlr:4.0 ilmb_bram_if_cntlr
set_property -dict {CONFIG.C_ECC 0} [get_bd_cells ilmb_bram_if_cntlr]
create_bd_cell -type ip -vlnv xilinx.com:ip:blk_mem_gen:8.4 lmb_bram
set_property -dict [list \
  CONFIG.Enable_B Use_ENB_Pin \
  CONFIG.Memory_Type True_Dual_Port_RAM \
  CONFIG.Port_B_Clock 100 \
  CONFIG.Port_B_Enable_Rate 100 \
  CONFIG.Port_B_Write_Rate 50 \
  CONFIG.Use_RSTB_Pin true \
  CONFIG.use_bram_block BRAM_Controller \
] [get_bd_cells lmb_bram]

# ---- connections ----

current_bd_instance /microblaze_0_local_memory
connect_bd_intf_net -intf_net microblaze_0_dlmb [get_bd_intf_pins DLMB] [get_bd_intf_pins dlmb_v10/LMB_M]
connect_bd_intf_net -intf_net microblaze_0_dlmb_bus [get_bd_intf_pins dlmb_v10/LMB_Sl_0] [get_bd_intf_pins dlmb_bram_if_cntlr/SLMB]
connect_bd_intf_net -intf_net microblaze_0_dlmb_cntlr [get_bd_intf_pins dlmb_bram_if_cntlr/BRAM_PORT] [get_bd_intf_pins lmb_bram/BRAM_PORTA]
connect_bd_intf_net -intf_net microblaze_0_ilmb [get_bd_intf_pins ILMB] [get_bd_intf_pins ilmb_v10/LMB_M]
connect_bd_intf_net -intf_net microblaze_0_ilmb_bus [get_bd_intf_pins ilmb_v10/LMB_Sl_0] [get_bd_intf_pins ilmb_bram_if_cntlr/SLMB]
connect_bd_intf_net -intf_net microblaze_0_ilmb_cntlr [get_bd_intf_pins ilmb_bram_if_cntlr/BRAM_PORT] [get_bd_intf_pins lmb_bram/BRAM_PORTB]
connect_bd_net [get_bd_pins SYS_Rst] \
  [get_bd_pins dlmb_bram_if_cntlr/LMB_Rst] [get_bd_pins dlmb_v10/SYS_Rst] [get_bd_pins ilmb_bram_if_cntlr/LMB_Rst] \
  [get_bd_pins ilmb_v10/SYS_Rst]
connect_bd_net -net microblaze_0_Clk [get_bd_pins LMB_Clk] \
  [get_bd_pins dlmb_bram_if_cntlr/LMB_Clk] [get_bd_pins dlmb_v10/LMB_Clk] [get_bd_pins ilmb_bram_if_cntlr/LMB_Clk] \
  [get_bd_pins ilmb_v10/LMB_Clk]
set_property HDL_ATTRIBUTE.BMM_INFO_ADDRESS_SPACE {byte  0x00000000 32 > top microblaze_0_local_memory/lmb_bram} [get_bd_cells dlmb_bram_if_cntlr]
set_property HDL_ATTRIBUTE.KEEP_HIERARCHY yes [get_bd_cells dlmb_bram_if_cntlr]

current_bd_instance /
connect_bd_intf_net [get_bd_intf_pins axi_dma_0/M_AXIS_MM2S] [get_bd_intf_pins conv2d_0/video_in]
connect_bd_intf_net [get_bd_intf_pins axi_dma_1/M_AXIS_MM2S] [get_bd_intf_pins din_cc/S_AXIS]
connect_bd_intf_net [get_bd_intf_pins axi_dma_1/M_AXI_MM2S] [get_bd_intf_pins axi_smc/S04_AXI]
connect_bd_intf_net [get_bd_intf_pins axi_dma_1/M_AXI_S2MM] [get_bd_intf_pins axi_smc/S05_AXI]
connect_bd_intf_net [get_bd_intf_ports bpi_flash] [get_bd_intf_pins axi_emc_0/EMC_INTF]
connect_bd_intf_net [get_bd_intf_ports led_3bits] [get_bd_intf_pins axi_gpio_0/GPIO]
connect_bd_intf_net [get_bd_intf_ports alert_lm73] [get_bd_intf_pins axi_gpio_0/GPIO2]
connect_bd_intf_net [get_bd_intf_ports iic_lm73] [get_bd_intf_pins axi_iic_0/IIC]
connect_bd_intf_net [get_bd_intf_ports iic_pcie] [get_bd_intf_pins axi_iic_1/IIC]
connect_bd_intf_net -intf_net axi_lite_M01_AXI [get_bd_intf_pins axi_lite/M00_AXI] [get_bd_intf_pins axi_dma_0/S_AXI_LITE]
connect_bd_intf_net [get_bd_intf_pins axi_lite/M01_AXI] [get_bd_intf_pins conv2d_0/s_axi_control]
connect_bd_intf_net [get_bd_intf_pins axi_dma_1/S_AXI_LITE] [get_bd_intf_pins axi_lite/M02_AXI]
connect_bd_intf_net [get_bd_intf_pins axi_lite/M03_AXI] [get_bd_intf_pins lite_cc/S_AXI]
connect_bd_intf_net [get_bd_intf_pins axi_smc/M00_AXI] [get_bd_intf_pins mig_7series_0/S0_AXI]
connect_bd_intf_net [get_bd_intf_pins axi_smc/M01_AXI] [get_bd_intf_pins mig_7series_0/S1_AXI]
connect_bd_intf_net [get_bd_intf_pins conv2d_0/video_out] [get_bd_intf_pins axi_dma_0/S_AXIS_S2MM]
connect_bd_intf_net [get_bd_intf_pins din_cc/M_AXIS] [get_bd_intf_pins wiener_0/din]
connect_bd_intf_net [get_bd_intf_pins din_cc/M_AXIS] [get_bd_intf_pins dbg_ila/SLOT_0_AXIS]
connect_bd_intf_net [get_bd_intf_pins dout_cc/M_AXIS] [get_bd_intf_pins axi_dma_1/S_AXIS_S2MM]
connect_bd_intf_net [get_bd_intf_pins fft_fwd_0/M_AXIS_DATA] [get_bd_intf_pins fwd_fifo_0/S_AXIS]
connect_bd_intf_net [get_bd_intf_pins fft_fwd_0/M_AXIS_DATA] [get_bd_intf_pins dbg_ila/SLOT_2_AXIS]
connect_bd_intf_net [get_bd_intf_pins fft_fwd_1/M_AXIS_DATA] [get_bd_intf_pins fwd_fifo_1/S_AXIS]
connect_bd_intf_net [get_bd_intf_pins fft_fwd_2/M_AXIS_DATA] [get_bd_intf_pins fwd_fifo_2/S_AXIS]
connect_bd_intf_net [get_bd_intf_pins fft_fwd_3/M_AXIS_DATA] [get_bd_intf_pins fwd_fifo_3/S_AXIS]
connect_bd_intf_net [get_bd_intf_pins fft_fwd_4/M_AXIS_DATA] [get_bd_intf_pins fwd_fifo_4/S_AXIS]
connect_bd_intf_net [get_bd_intf_pins fft_fwd_5/M_AXIS_DATA] [get_bd_intf_pins fwd_fifo_5/S_AXIS]
connect_bd_intf_net [get_bd_intf_pins fft_fwd_6/M_AXIS_DATA] [get_bd_intf_pins fwd_fifo_6/S_AXIS]
connect_bd_intf_net [get_bd_intf_pins fft_fwd_7/M_AXIS_DATA] [get_bd_intf_pins fwd_fifo_7/S_AXIS]
connect_bd_intf_net [get_bd_intf_pins fft_inv_0/M_AXIS_DATA] [get_bd_intf_pins inv_fifo_0/S_AXIS]
connect_bd_intf_net [get_bd_intf_pins fft_inv_1/M_AXIS_DATA] [get_bd_intf_pins inv_fifo_1/S_AXIS]
connect_bd_intf_net [get_bd_intf_pins fft_inv_2/M_AXIS_DATA] [get_bd_intf_pins inv_fifo_2/S_AXIS]
connect_bd_intf_net [get_bd_intf_pins fft_inv_3/M_AXIS_DATA] [get_bd_intf_pins inv_fifo_3/S_AXIS]
connect_bd_intf_net [get_bd_intf_pins fft_inv_4/M_AXIS_DATA] [get_bd_intf_pins inv_fifo_4/S_AXIS]
connect_bd_intf_net [get_bd_intf_pins fft_inv_5/M_AXIS_DATA] [get_bd_intf_pins inv_fifo_5/S_AXIS]
connect_bd_intf_net [get_bd_intf_pins fft_inv_6/M_AXIS_DATA] [get_bd_intf_pins inv_fifo_6/S_AXIS]
connect_bd_intf_net [get_bd_intf_pins fft_inv_7/M_AXIS_DATA] [get_bd_intf_pins inv_fifo_7/S_AXIS]
connect_bd_intf_net [get_bd_intf_pins fwd_fifo_0/M_AXIS] [get_bd_intf_pins wiener_0/fwd_out_0]
connect_bd_intf_net [get_bd_intf_pins fwd_fifo_1/M_AXIS] [get_bd_intf_pins wiener_0/fwd_out_1]
connect_bd_intf_net [get_bd_intf_pins fwd_fifo_2/M_AXIS] [get_bd_intf_pins wiener_0/fwd_out_2]
connect_bd_intf_net [get_bd_intf_pins fwd_fifo_3/M_AXIS] [get_bd_intf_pins wiener_0/fwd_out_3]
connect_bd_intf_net [get_bd_intf_pins fwd_fifo_4/M_AXIS] [get_bd_intf_pins wiener_0/fwd_out_4]
connect_bd_intf_net [get_bd_intf_pins fwd_fifo_5/M_AXIS] [get_bd_intf_pins wiener_0/fwd_out_5]
connect_bd_intf_net [get_bd_intf_pins fwd_fifo_6/M_AXIS] [get_bd_intf_pins wiener_0/fwd_out_6]
connect_bd_intf_net [get_bd_intf_pins fwd_fifo_7/M_AXIS] [get_bd_intf_pins wiener_0/fwd_out_7]
connect_bd_intf_net [get_bd_intf_pins inv_fifo_0/M_AXIS] [get_bd_intf_pins wiener_0/inv_out_0]
connect_bd_intf_net [get_bd_intf_pins inv_fifo_0/M_AXIS] [get_bd_intf_pins dbg_ila/SLOT_4_AXIS]
connect_bd_intf_net [get_bd_intf_pins inv_fifo_1/M_AXIS] [get_bd_intf_pins wiener_0/inv_out_1]
connect_bd_intf_net [get_bd_intf_pins inv_fifo_2/M_AXIS] [get_bd_intf_pins wiener_0/inv_out_2]
connect_bd_intf_net [get_bd_intf_pins inv_fifo_3/M_AXIS] [get_bd_intf_pins wiener_0/inv_out_3]
connect_bd_intf_net [get_bd_intf_pins inv_fifo_4/M_AXIS] [get_bd_intf_pins wiener_0/inv_out_4]
connect_bd_intf_net [get_bd_intf_pins inv_fifo_5/M_AXIS] [get_bd_intf_pins wiener_0/inv_out_5]
connect_bd_intf_net [get_bd_intf_pins inv_fifo_6/M_AXIS] [get_bd_intf_pins wiener_0/inv_out_6]
connect_bd_intf_net [get_bd_intf_pins inv_fifo_7/M_AXIS] [get_bd_intf_pins wiener_0/inv_out_7]
connect_bd_intf_net [get_bd_intf_pins lite_cc/M_AXI] [get_bd_intf_pins wiener_0/s_axi_control]
connect_bd_intf_net [get_bd_intf_pins microblaze_0/M_AXI_DC] [get_bd_intf_pins axi_smc/S00_AXI]
connect_bd_intf_net -intf_net microblaze_0_axi_dp [get_bd_intf_pins microblaze_0_axi_periph/S00_AXI] [get_bd_intf_pins microblaze_0/M_AXI_DP]
connect_bd_intf_net [get_bd_intf_pins microblaze_0_axi_periph/M02_AXI] [get_bd_intf_pins mig_7series_0/S0_AXI_CTRL]
connect_bd_intf_net [get_bd_intf_pins microblaze_0_axi_periph/M03_AXI] [get_bd_intf_pins mig_7series_0/S1_AXI_CTRL]
connect_bd_intf_net [get_bd_intf_pins microblaze_0_axi_periph/M04_AXI] [get_bd_intf_pins axi_gpio_0/S_AXI]
connect_bd_intf_net [get_bd_intf_pins microblaze_0_axi_periph/M05_AXI] [get_bd_intf_pins axi_iic_0/S_AXI]
connect_bd_intf_net [get_bd_intf_pins microblaze_0_axi_periph/M06_AXI] [get_bd_intf_pins axi_iic_1/S_AXI]
connect_bd_intf_net [get_bd_intf_pins microblaze_0_axi_periph/M08_AXI] [get_bd_intf_pins axi_emc_0/S_AXI_MEM]
connect_bd_intf_net [get_bd_intf_pins mdm_1/MBDEBUG_0] [get_bd_intf_pins microblaze_0/DEBUG]
connect_bd_intf_net [get_bd_intf_pins microblaze_0/DLMB] [get_bd_intf_pins microblaze_0_local_memory/DLMB]
connect_bd_intf_net [get_bd_intf_pins microblaze_0/ILMB] [get_bd_intf_pins microblaze_0_local_memory/ILMB]
connect_bd_intf_net -intf_net microblaze_0_intc_axi [get_bd_intf_pins microblaze_0_axi_periph/M00_AXI] [get_bd_intf_pins microblaze_0_axi_intc/s_axi]
connect_bd_intf_net [get_bd_intf_pins microblaze_0_axi_intc/interrupt] [get_bd_intf_pins microblaze_0/INTERRUPT]
connect_bd_intf_net -intf_net microblaze_0_mdm_axi [get_bd_intf_pins microblaze_0_axi_periph/M01_AXI] [get_bd_intf_pins mdm_1/S_AXI]
connect_bd_intf_net [get_bd_intf_ports DDR3_0] [get_bd_intf_pins mig_7series_0/C0_DDR3]
connect_bd_intf_net [get_bd_intf_ports DDR3_1] [get_bd_intf_pins mig_7series_0/C1_DDR3]
connect_bd_intf_net [get_bd_intf_ports pcie_refclk] [get_bd_intf_pins util_ds_buf/CLK_IN_D]
connect_bd_intf_net -intf_net sys_diff_clock_0_1 [get_bd_intf_ports DDR3_CLK_1] [get_bd_intf_pins mig_7series_0/C1_SYS_CLK]
connect_bd_intf_net -intf_net sys_diff_clock_1 [get_bd_intf_ports DDR3_CLK_0] [get_bd_intf_pins mig_7series_0/C0_SYS_CLK]
connect_bd_intf_net -intf_net vdma_0_M_AXI_MM2S [get_bd_intf_pins axi_smc/S02_AXI] [get_bd_intf_pins axi_dma_0/M_AXI_MM2S]
connect_bd_intf_net -intf_net vdma_0_M_AXI_S2MM [get_bd_intf_pins axi_smc/S03_AXI] [get_bd_intf_pins axi_dma_0/M_AXI_S2MM]
connect_bd_intf_net [get_bd_intf_pins wiener_0/dout] [get_bd_intf_pins dout_cc/S_AXIS]
connect_bd_intf_net [get_bd_intf_pins wiener_0/dout] [get_bd_intf_pins dbg_ila/SLOT_5_AXIS]
connect_bd_intf_net [get_bd_intf_pins wiener_0/fwd_in_0] [get_bd_intf_pins fft_fwd_0/S_AXIS_DATA]
connect_bd_intf_net [get_bd_intf_pins wiener_0/fwd_in_0] [get_bd_intf_pins dbg_ila/SLOT_1_AXIS]
connect_bd_intf_net [get_bd_intf_pins wiener_0/fwd_in_1] [get_bd_intf_pins fft_fwd_1/S_AXIS_DATA]
connect_bd_intf_net [get_bd_intf_pins wiener_0/fwd_in_2] [get_bd_intf_pins fft_fwd_2/S_AXIS_DATA]
connect_bd_intf_net [get_bd_intf_pins wiener_0/fwd_in_3] [get_bd_intf_pins fft_fwd_3/S_AXIS_DATA]
connect_bd_intf_net [get_bd_intf_pins wiener_0/fwd_in_4] [get_bd_intf_pins fft_fwd_4/S_AXIS_DATA]
connect_bd_intf_net [get_bd_intf_pins wiener_0/fwd_in_5] [get_bd_intf_pins fft_fwd_5/S_AXIS_DATA]
connect_bd_intf_net [get_bd_intf_pins wiener_0/fwd_in_6] [get_bd_intf_pins fft_fwd_6/S_AXIS_DATA]
connect_bd_intf_net [get_bd_intf_pins wiener_0/fwd_in_7] [get_bd_intf_pins fft_fwd_7/S_AXIS_DATA]
connect_bd_intf_net [get_bd_intf_pins wiener_0/inv_in_0] [get_bd_intf_pins fft_inv_0/S_AXIS_DATA]
connect_bd_intf_net [get_bd_intf_pins wiener_0/inv_in_0] [get_bd_intf_pins dbg_ila/SLOT_3_AXIS]
connect_bd_intf_net [get_bd_intf_pins wiener_0/inv_in_1] [get_bd_intf_pins fft_inv_1/S_AXIS_DATA]
connect_bd_intf_net [get_bd_intf_pins wiener_0/inv_in_2] [get_bd_intf_pins fft_inv_2/S_AXIS_DATA]
connect_bd_intf_net [get_bd_intf_pins wiener_0/inv_in_3] [get_bd_intf_pins fft_inv_3/S_AXIS_DATA]
connect_bd_intf_net [get_bd_intf_pins wiener_0/inv_in_4] [get_bd_intf_pins fft_inv_4/S_AXIS_DATA]
connect_bd_intf_net [get_bd_intf_pins wiener_0/inv_in_5] [get_bd_intf_pins fft_inv_5/S_AXIS_DATA]
connect_bd_intf_net [get_bd_intf_pins wiener_0/inv_in_6] [get_bd_intf_pins fft_inv_6/S_AXIS_DATA]
connect_bd_intf_net [get_bd_intf_pins wiener_0/inv_in_7] [get_bd_intf_pins fft_inv_7/S_AXIS_DATA]
connect_bd_intf_net [get_bd_intf_pins xdma_0/M_AXI] [get_bd_intf_pins axi_smc/S01_AXI]
connect_bd_intf_net [get_bd_intf_pins xdma_0/M_AXI_LITE] [get_bd_intf_pins axi_lite/S00_AXI]
connect_bd_intf_net [get_bd_intf_ports pci_express_x8] [get_bd_intf_pins xdma_0/pcie_mgt]
connect_bd_net [get_bd_pins axi_gpio_0/ip2intc_irpt] [get_bd_pins microblaze_0_xlconcat/In4]
connect_bd_net [get_bd_pins axi_iic_0/iic2intc_irpt] [get_bd_pins microblaze_0_xlconcat/In0]
connect_bd_net [get_bd_pins axi_iic_1/iic2intc_irpt] [get_bd_pins microblaze_0_xlconcat/In1]
connect_bd_net [get_bd_pins clk_wiz_1/clk_out2] [get_bd_pins axi_smc/aclk4]
connect_bd_net [get_bd_pins clk_wiz_1/clk_out3] \
  [get_bd_pins rst_215/slowest_sync_clk] [get_bd_pins din_cc/m_axis_aclk] [get_bd_pins dout_cc/s_axis_aclk] \
  [get_bd_pins lite_cc/m_axi_aclk] [get_bd_pins fft_fwd_0/aclk] [get_bd_pins fft_inv_0/aclk] [get_bd_pins fft_fwd_1/aclk] \
  [get_bd_pins fft_inv_1/aclk] [get_bd_pins fft_fwd_2/aclk] [get_bd_pins fft_inv_2/aclk] [get_bd_pins fft_fwd_3/aclk] \
  [get_bd_pins fft_inv_3/aclk] [get_bd_pins fft_fwd_4/aclk] [get_bd_pins fft_inv_4/aclk] [get_bd_pins fft_fwd_5/aclk] \
  [get_bd_pins fft_inv_5/aclk] [get_bd_pins fft_fwd_6/aclk] [get_bd_pins fft_inv_6/aclk] [get_bd_pins fft_fwd_7/aclk] \
  [get_bd_pins fft_inv_7/aclk] [get_bd_pins fwd_fifo_0/s_axis_aclk] [get_bd_pins fwd_fifo_1/s_axis_aclk] \
  [get_bd_pins fwd_fifo_2/s_axis_aclk] [get_bd_pins fwd_fifo_3/s_axis_aclk] [get_bd_pins fwd_fifo_4/s_axis_aclk] \
  [get_bd_pins fwd_fifo_5/s_axis_aclk] [get_bd_pins fwd_fifo_6/s_axis_aclk] [get_bd_pins fwd_fifo_7/s_axis_aclk] \
  [get_bd_pins inv_fifo_0/s_axis_aclk] [get_bd_pins inv_fifo_1/s_axis_aclk] [get_bd_pins inv_fifo_2/s_axis_aclk] \
  [get_bd_pins inv_fifo_3/s_axis_aclk] [get_bd_pins inv_fifo_4/s_axis_aclk] [get_bd_pins inv_fifo_5/s_axis_aclk] \
  [get_bd_pins inv_fifo_6/s_axis_aclk] [get_bd_pins inv_fifo_7/s_axis_aclk] [get_bd_pins dbg_ila/clk] \
  [get_bd_pins wiener_0/ap_clk]
connect_bd_net [get_bd_pins clk_wiz_1/locked] [get_bd_pins rst_clk_wiz_1_100M/dcm_locked] [get_bd_pins rst_215/dcm_locked]
connect_bd_net [get_bd_pins const_c0/dout] \
  [get_bd_pins fft_fwd_0/s_axis_config_tdata] [get_bd_pins fft_fwd_1/s_axis_config_tdata] \
  [get_bd_pins fft_fwd_2/s_axis_config_tdata] [get_bd_pins fft_fwd_3/s_axis_config_tdata] \
  [get_bd_pins fft_fwd_4/s_axis_config_tdata] [get_bd_pins fft_fwd_5/s_axis_config_tdata] \
  [get_bd_pins fft_fwd_6/s_axis_config_tdata] [get_bd_pins fft_fwd_7/s_axis_config_tdata]
connect_bd_net [get_bd_pins const_c1/dout] \
  [get_bd_pins fft_inv_0/s_axis_config_tdata] [get_bd_pins fft_inv_1/s_axis_config_tdata] \
  [get_bd_pins fft_inv_2/s_axis_config_tdata] [get_bd_pins fft_inv_3/s_axis_config_tdata] \
  [get_bd_pins fft_inv_4/s_axis_config_tdata] [get_bd_pins fft_inv_5/s_axis_config_tdata] \
  [get_bd_pins fft_inv_6/s_axis_config_tdata] [get_bd_pins fft_inv_7/s_axis_config_tdata]
connect_bd_net [get_bd_pins const_one/dout] \
  [get_bd_pins fft_fwd_0/aclken] [get_bd_pins fft_inv_0/aclken] [get_bd_pins fft_fwd_1/aclken] [get_bd_pins fft_inv_1/aclken] \
  [get_bd_pins fft_fwd_2/aclken] [get_bd_pins fft_inv_2/aclken] [get_bd_pins fft_fwd_3/aclken] [get_bd_pins fft_inv_3/aclken] \
  [get_bd_pins fft_fwd_4/aclken] [get_bd_pins fft_inv_4/aclken] [get_bd_pins fft_fwd_5/aclken] [get_bd_pins fft_inv_5/aclken] \
  [get_bd_pins fft_fwd_6/aclken] [get_bd_pins fft_inv_6/aclken] [get_bd_pins fft_fwd_7/aclken] [get_bd_pins fft_inv_7/aclken] \
  [get_bd_pins fft_fwd_0/s_axis_config_tvalid] [get_bd_pins fft_fwd_1/s_axis_config_tvalid] \
  [get_bd_pins fft_fwd_2/s_axis_config_tvalid] [get_bd_pins fft_fwd_3/s_axis_config_tvalid] \
  [get_bd_pins fft_fwd_4/s_axis_config_tvalid] [get_bd_pins fft_fwd_5/s_axis_config_tvalid] \
  [get_bd_pins fft_fwd_6/s_axis_config_tvalid] [get_bd_pins fft_fwd_7/s_axis_config_tvalid] \
  [get_bd_pins fft_inv_0/s_axis_config_tvalid] [get_bd_pins fft_inv_1/s_axis_config_tvalid] \
  [get_bd_pins fft_inv_2/s_axis_config_tvalid] [get_bd_pins fft_inv_3/s_axis_config_tvalid] \
  [get_bd_pins fft_inv_4/s_axis_config_tvalid] [get_bd_pins fft_inv_5/s_axis_config_tvalid] \
  [get_bd_pins fft_inv_6/s_axis_config_tvalid] [get_bd_pins fft_inv_7/s_axis_config_tvalid]
connect_bd_net -net default_50mhz_clk0_1 [get_bd_ports SYS_CLK] [get_bd_pins clk_wiz_1/clk_in1]
connect_bd_net [get_bd_pins mdm_1/Debug_SYS_Rst] [get_bd_pins rst_clk_wiz_1_100M/mb_debug_sys_rst]
connect_bd_net -net microblaze_0_Clk [get_bd_pins clk_wiz_1/clk_out1] \
  [get_bd_pins microblaze_0_local_memory/LMB_Clk] [get_bd_pins axi_emc_0/s_axi_aclk] [get_bd_pins axi_emc_0/rdclk] \
  [get_bd_pins axi_gpio_0/s_axi_aclk] [get_bd_pins axi_iic_0/s_axi_aclk] [get_bd_pins axi_iic_1/s_axi_aclk] \
  [get_bd_pins axi_smc/aclk1] [get_bd_pins mdm_1/S_AXI_ACLK] [get_bd_pins microblaze_0/Clk] \
  [get_bd_pins microblaze_0_axi_intc/s_axi_aclk] [get_bd_pins microblaze_0_axi_intc/processor_clk] \
  [get_bd_pins microblaze_0_axi_periph/ACLK] [get_bd_pins microblaze_0_axi_periph/S00_ACLK] \
  [get_bd_pins microblaze_0_axi_periph/M00_ACLK] [get_bd_pins microblaze_0_axi_periph/M01_ACLK] \
  [get_bd_pins microblaze_0_axi_periph/M04_ACLK] [get_bd_pins microblaze_0_axi_periph/M05_ACLK] \
  [get_bd_pins microblaze_0_axi_periph/M06_ACLK] [get_bd_pins microblaze_0_axi_periph/M08_ACLK] \
  [get_bd_pins rst_clk_wiz_1_100M/slowest_sync_clk]
connect_bd_net -net microblaze_0_intr [get_bd_pins microblaze_0_xlconcat/dout] [get_bd_pins microblaze_0_axi_intc/intr]
connect_bd_net [get_bd_pins mig_7series_0/c0_interrupt] [get_bd_pins microblaze_0_xlconcat/In2]
connect_bd_net [get_bd_pins mig_7series_0/c0_mmcm_locked] [get_bd_pins rst_mig_7series_0_133M/dcm_locked]
connect_bd_net [get_bd_pins mig_7series_0/c0_ui_clk] \
  [get_bd_pins axi_smc/aclk] [get_bd_pins microblaze_0_axi_periph/M02_ACLK] \
  [get_bd_pins rst_mig_7series_0_133M/slowest_sync_clk]
connect_bd_net [get_bd_pins mig_7series_0/c0_ui_clk_sync_rst] [get_bd_pins rst_mig_7series_0_133M/ext_reset_in]
connect_bd_net [get_bd_pins mig_7series_0/c1_interrupt] [get_bd_pins microblaze_0_xlconcat/In3]
connect_bd_net [get_bd_pins mig_7series_0/c1_mmcm_locked] [get_bd_pins rst_mig_7series_0_133M_1/dcm_locked]
connect_bd_net [get_bd_pins mig_7series_0/c1_ui_clk] \
  [get_bd_pins axi_smc/aclk2] [get_bd_pins microblaze_0_axi_periph/M03_ACLK] \
  [get_bd_pins rst_mig_7series_0_133M_1/slowest_sync_clk]
connect_bd_net [get_bd_pins mig_7series_0/c1_ui_clk_sync_rst] [get_bd_pins rst_mig_7series_0_133M_1/ext_reset_in]
connect_bd_net [get_bd_ports pcie_perstn] [get_bd_pins xdma_0/sys_rst_n]
connect_bd_net -net resetn_1 [get_bd_ports SYS_RSTN] \
  [get_bd_pins mig_7series_0/sys_rst] [get_bd_pins resetn_inv_0/Op1] [get_bd_pins rst_clk_wiz_1_100M/ext_reset_in]
connect_bd_net [get_bd_pins resetn_inv_0/Res] [get_bd_pins clk_wiz_1/reset] [get_bd_pins rst_215/ext_reset_in]
connect_bd_net [get_bd_pins rst_215/peripheral_aresetn] \
  [get_bd_pins din_cc/m_axis_aresetn] [get_bd_pins dout_cc/s_axis_aresetn] [get_bd_pins lite_cc/m_axi_aresetn] \
  [get_bd_pins fft_fwd_0/aresetn] [get_bd_pins fft_inv_0/aresetn] [get_bd_pins fft_fwd_1/aresetn] \
  [get_bd_pins fft_inv_1/aresetn] [get_bd_pins fft_fwd_2/aresetn] [get_bd_pins fft_inv_2/aresetn] \
  [get_bd_pins fft_fwd_3/aresetn] [get_bd_pins fft_inv_3/aresetn] [get_bd_pins fft_fwd_4/aresetn] \
  [get_bd_pins fft_inv_4/aresetn] [get_bd_pins fft_fwd_5/aresetn] [get_bd_pins fft_inv_5/aresetn] \
  [get_bd_pins fft_fwd_6/aresetn] [get_bd_pins fft_inv_6/aresetn] [get_bd_pins fft_fwd_7/aresetn] \
  [get_bd_pins fft_inv_7/aresetn] [get_bd_pins fwd_fifo_0/s_axis_aresetn] [get_bd_pins fwd_fifo_1/s_axis_aresetn] \
  [get_bd_pins fwd_fifo_2/s_axis_aresetn] [get_bd_pins fwd_fifo_3/s_axis_aresetn] [get_bd_pins fwd_fifo_4/s_axis_aresetn] \
  [get_bd_pins fwd_fifo_5/s_axis_aresetn] [get_bd_pins fwd_fifo_6/s_axis_aresetn] [get_bd_pins fwd_fifo_7/s_axis_aresetn] \
  [get_bd_pins inv_fifo_0/s_axis_aresetn] [get_bd_pins inv_fifo_1/s_axis_aresetn] [get_bd_pins inv_fifo_2/s_axis_aresetn] \
  [get_bd_pins inv_fifo_3/s_axis_aresetn] [get_bd_pins inv_fifo_4/s_axis_aresetn] [get_bd_pins inv_fifo_5/s_axis_aresetn] \
  [get_bd_pins inv_fifo_6/s_axis_aresetn] [get_bd_pins inv_fifo_7/s_axis_aresetn] [get_bd_pins dbg_ila/resetn] \
  [get_bd_pins wiener_0/ap_rst_n]
# net rst_215_peripheral_reset has one end: rst_215/peripheral_reset
connect_bd_net [get_bd_pins rst_clk_wiz_1_100M/bus_struct_reset] [get_bd_pins microblaze_0_local_memory/SYS_Rst]
connect_bd_net [get_bd_pins rst_clk_wiz_1_100M/mb_reset] [get_bd_pins microblaze_0/Reset] [get_bd_pins microblaze_0_axi_intc/processor_rst]
connect_bd_net [get_bd_pins rst_clk_wiz_1_100M/peripheral_aresetn] \
  [get_bd_pins axi_emc_0/s_axi_aresetn] [get_bd_pins axi_gpio_0/s_axi_aresetn] [get_bd_pins axi_iic_0/s_axi_aresetn] \
  [get_bd_pins axi_iic_1/s_axi_aresetn] [get_bd_pins axi_smc/aresetn] [get_bd_pins mdm_1/S_AXI_ARESETN] \
  [get_bd_pins microblaze_0_axi_intc/s_axi_aresetn] [get_bd_pins microblaze_0_axi_periph/ARESETN] \
  [get_bd_pins microblaze_0_axi_periph/S00_ARESETN] [get_bd_pins microblaze_0_axi_periph/M00_ARESETN] \
  [get_bd_pins microblaze_0_axi_periph/M01_ARESETN] [get_bd_pins microblaze_0_axi_periph/M04_ARESETN] \
  [get_bd_pins microblaze_0_axi_periph/M05_ARESETN] [get_bd_pins microblaze_0_axi_periph/M06_ARESETN] \
  [get_bd_pins microblaze_0_axi_periph/M08_ARESETN]
connect_bd_net [get_bd_pins rst_mig_7series_0_133M_1/peripheral_aresetn] \
  [get_bd_pins microblaze_0_axi_periph/M03_ARESETN] [get_bd_pins mig_7series_0/c1_aresetn]
connect_bd_net [get_bd_pins rst_mig_7series_0_133M/peripheral_aresetn] \
  [get_bd_pins microblaze_0_axi_periph/M02_ARESETN] [get_bd_pins mig_7series_0/c0_aresetn]
connect_bd_net [get_bd_pins util_ds_buf/IBUF_OUT] [get_bd_pins xdma_0/sys_clk]
connect_bd_net [get_bd_pins xdma_0/axi_aclk] \
  [get_bd_pins axi_smc/aclk3] [get_bd_pins microblaze_0_axi_periph/M07_ACLK] [get_bd_pins axi_dma_0/s_axi_lite_aclk] \
  [get_bd_pins axi_dma_0/m_axi_mm2s_aclk] [get_bd_pins axi_dma_0/m_axi_s2mm_aclk] [get_bd_pins axi_lite/ACLK] \
  [get_bd_pins axi_lite/M00_ACLK] [get_bd_pins axi_lite/M01_ACLK] [get_bd_pins axi_lite/S00_ACLK] \
  [get_bd_pins conv2d_0/ap_clk] [get_bd_pins axi_dma_1/s_axi_lite_aclk] [get_bd_pins axi_dma_1/m_axi_mm2s_aclk] \
  [get_bd_pins axi_dma_1/m_axi_s2mm_aclk] [get_bd_pins axi_lite/M02_ACLK] [get_bd_pins axi_lite/M03_ACLK] \
  [get_bd_pins din_cc/s_axis_aclk] [get_bd_pins dout_cc/m_axis_aclk] [get_bd_pins lite_cc/s_axi_aclk]
connect_bd_net [get_bd_pins xdma_0/axi_aresetn] \
  [get_bd_pins microblaze_0_axi_periph/M07_ARESETN] [get_bd_pins axi_dma_0/axi_resetn] [get_bd_pins axi_lite/ARESETN] \
  [get_bd_pins axi_lite/M00_ARESETN] [get_bd_pins axi_lite/M01_ARESETN] [get_bd_pins axi_lite/S00_ARESETN] \
  [get_bd_pins conv2d_0/ap_rst_n] [get_bd_pins axi_dma_1/axi_resetn] [get_bd_pins axi_lite/M02_ARESETN] \
  [get_bd_pins axi_lite/M03_ARESETN] [get_bd_pins din_cc/s_axis_aresetn] [get_bd_pins dout_cc/m_axis_aresetn] \
  [get_bd_pins lite_cc/s_axi_aresetn]
set_property HDL_ATTRIBUTE.BMM_INFO_PROCESSOR {microblaze-le > top microblaze_0_local_memory/dlmb_bram_if_cntlr} [get_bd_cells microblaze_0]
set_property HDL_ATTRIBUTE.KEEP_HIERARCHY yes [get_bd_cells microblaze_0]

# ---- address map ----
assign_bd_address -offset 0x00000000 -range 2G -target_address_space [get_bd_addr_spaces axi_dma_0/Data_MM2S] [get_bd_addr_segs mig_7series_0/c0_memmap/c0_memaddr]
assign_bd_address -offset 0x00000000 -range 2G -target_address_space [get_bd_addr_spaces axi_dma_0/Data_S2MM] [get_bd_addr_segs mig_7series_0/c0_memmap/c0_memaddr]
assign_bd_address -offset 0x00000000 -range 2G -target_address_space [get_bd_addr_spaces axi_dma_1/Data_MM2S] [get_bd_addr_segs mig_7series_0/c0_memmap/c0_memaddr]
assign_bd_address -offset 0x00000000 -range 2G -target_address_space [get_bd_addr_spaces axi_dma_1/Data_S2MM] [get_bd_addr_segs mig_7series_0/c0_memmap/c0_memaddr]
assign_bd_address -offset 0x000000000 -range 512K -target_address_space [get_bd_addr_spaces microblaze_0/Data] [get_bd_addr_segs microblaze_0_local_memory/dlmb_bram_if_cntlr/SLMB/Mem]
assign_bd_address -offset 0x040000000 -range 64K -target_address_space [get_bd_addr_spaces microblaze_0/Data] [get_bd_addr_segs axi_gpio_0/S_AXI/Reg]
assign_bd_address -offset 0x040800000 -range 64K -target_address_space [get_bd_addr_spaces microblaze_0/Data] [get_bd_addr_segs axi_iic_0/S_AXI/Reg]
assign_bd_address -offset 0x040810000 -range 64K -target_address_space [get_bd_addr_spaces microblaze_0/Data] [get_bd_addr_segs axi_iic_1/S_AXI/Reg]
assign_bd_address -offset 0x041200000 -range 64K -target_address_space [get_bd_addr_spaces microblaze_0/Data] [get_bd_addr_segs microblaze_0_axi_intc/S_AXI/Reg]
assign_bd_address -offset 0x041400000 -range 4K -target_address_space [get_bd_addr_spaces microblaze_0/Data] [get_bd_addr_segs mdm_1/S_AXI/Reg]
assign_bd_address -offset 0x060000000 -range 64M -target_address_space [get_bd_addr_spaces microblaze_0/Data] [get_bd_addr_segs axi_emc_0/S_AXI_MEM/MEM0]
assign_bd_address -offset 0x076100000 -range 1M -target_address_space [get_bd_addr_spaces microblaze_0/Data] [get_bd_addr_segs mig_7series_0/c0_s_axi_ctrl_memmap/c0_s_axi_ctrl_memaddr]
assign_bd_address -offset 0x076200000 -range 1M -target_address_space [get_bd_addr_spaces microblaze_0/Data] [get_bd_addr_segs mig_7series_0/c1_s_axi_ctrl_memmap/c1_s_axi_ctrl_memaddr]
assign_bd_address -offset 0x100000000 -range 2G -target_address_space [get_bd_addr_spaces microblaze_0/Data] [get_bd_addr_segs mig_7series_0/c0_memmap/c0_memaddr]
assign_bd_address -offset 0x180000000 -range 2G -target_address_space [get_bd_addr_spaces microblaze_0/Data] [get_bd_addr_segs mig_7series_0/c1_memmap/c1_memaddr]
assign_bd_address -offset 0x00000000 -range 512K -target_address_space [get_bd_addr_spaces microblaze_0/Instruction] [get_bd_addr_segs microblaze_0_local_memory/ilmb_bram_if_cntlr/SLMB/Mem]
assign_bd_address -offset 0x0000000000000000 -range 2G -target_address_space [get_bd_addr_spaces xdma_0/M_AXI] [get_bd_addr_segs mig_7series_0/c0_memmap/c0_memaddr]
assign_bd_address -offset 0x0000000080000000 -range 2G -target_address_space [get_bd_addr_spaces xdma_0/M_AXI] [get_bd_addr_segs mig_7series_0/c1_memmap/c1_memaddr]
exclude_bd_addr_seg -offset 0x0000000060000000 -range 64M -target_address_space [get_bd_addr_spaces xdma_0/M_AXI] [get_bd_addr_segs axi_emc_0/S_AXI_MEM/MEM0]
assign_bd_address -offset 0x00000000 -range 4K -target_address_space [get_bd_addr_spaces xdma_0/M_AXI_LITE] [get_bd_addr_segs axi_dma_0/S_AXI_LITE/Reg]
assign_bd_address -offset 0x00001000 -range 4K -target_address_space [get_bd_addr_spaces xdma_0/M_AXI_LITE] [get_bd_addr_segs conv2d_0/s_axi_control/Reg]
assign_bd_address -offset 0x00002000 -range 4K -target_address_space [get_bd_addr_spaces xdma_0/M_AXI_LITE] [get_bd_addr_segs axi_dma_1/S_AXI_LITE/Reg]
assign_bd_address -offset 0x00004000 -range 8K -target_address_space [get_bd_addr_spaces xdma_0/M_AXI_LITE] [get_bd_addr_segs wiener_0/s_axi_control/Reg]

validate_bd_design
save_bd_design
